# Altium project NB3000AL.PRJPCB (part 4 of 4)

## Sheet CON_FFC40_LCDTFT.SCHDOC: LCD Module Connector
size A4; DocumentNumber: 63; Revision: 01; SheetNumber: 64; SheetTotal: 78
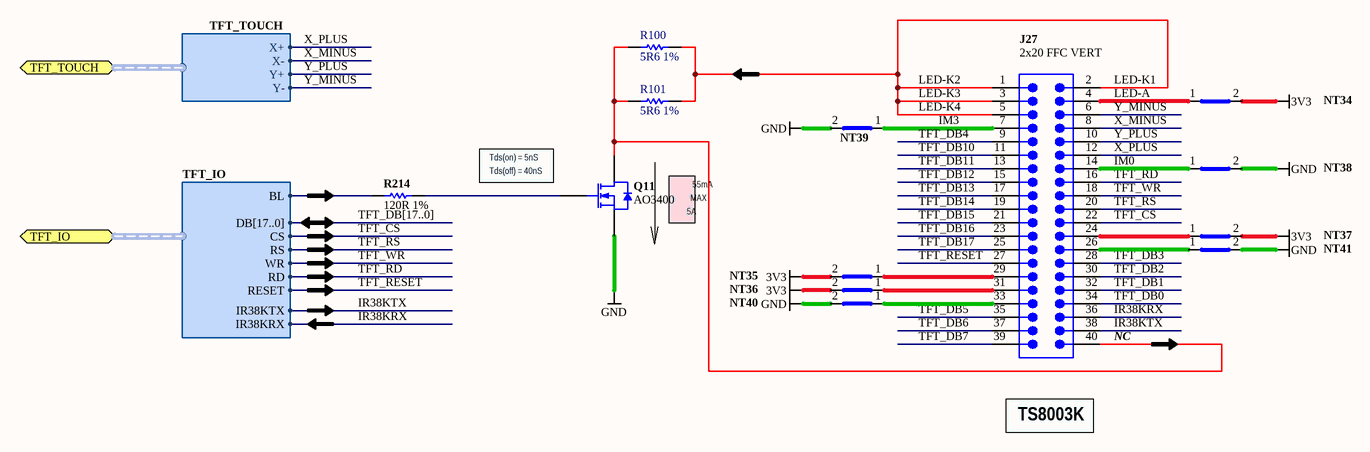
[diagram p27: CON_FFC40_LCDTFT.SCHDOC]

### Parts
J27  2x20 FFC VERT  [FPC-xxS1VN3R]
NT34  Net Tie SMT2  [NETTIE-SMT2-8X8]  (value not drawn)  (net tie, no BOM)
NT35  Net Tie SMT2  [NETTIE-SMT2-8X8]  (value not drawn)  (net tie, no BOM)
NT36  Net Tie SMT2  [NETTIE-SMT2-8X8]  (value not drawn)  (net tie, no BOM)
NT37  Net Tie SMT2  [NETTIE-SMT2-8X8]  (value not drawn)  (net tie, no BOM)
NT38  Net Tie SMT2  [NETTIE-SMT2-8X8]  (value not drawn)  (net tie, no BOM)
NT39  Net Tie SMT2  [NETTIE-SMT2-8X8]  (value not drawn)  (net tie, no BOM)
NT40  Net Tie SMT2  [NETTIE-SMT2-8X8]  (value not drawn)  (net tie, no BOM)
NT41  Net Tie SMT2  [NETTIE-SMT2-8X8]  (value not drawn)  (net tie, no BOM)
Q11  AO3400  [SOT95P230-3D]
R100  5R6 1%  [RESC1005-STAR]
R101  5R6 1%  [RESC1005-STAR]
R214  120R 1%  [RESC1005-STAR]

### Ports
TFT_IO (harness TFT_IO), TFT_TOUCH (harness TFT_TOUCH)

### Harnesses
TFT_IO: CS, RS, WR, RD, RESET, DB[17..0], BL, IR38KTX, IR38KRX
TFT_TOUCH: X+, X-, Y+, Y-

### Nets
3V3: NT34.2(Net2) NT35.2(Net2) NT36.2(Net2) NT37.2(Net2)
GND: NT38.2(Net2) NT39.2(Net2) NT40.2(Net2) NT41.2(Net2) Q11.3(S)
IR38KRX: J27.36 ; port TFT_IO.IR38KRX
IR38KTX: J27.38 ; port TFT_IO.IR38KTX
TFT_CS: J27.22 ; port TFT_IO.CS
TFT_DB0: J27.34
TFT_DB1: J27.32
TFT_DB2: J27.30
TFT_DB3: J27.28
TFT_DB4: J27.9
TFT_DB5: J27.35
TFT_DB6: J27.37
TFT_DB7: J27.39
TFT_DB10: J27.11
TFT_DB11: J27.13
TFT_DB12: J27.15
TFT_DB13: J27.17
TFT_DB14: J27.19
TFT_DB15: J27.21
TFT_DB16: J27.23
TFT_DB17: J27.25
TFT_RD: J27.16 ; port TFT_IO.RD
TFT_RESET: J27.27 ; port TFT_IO.RESET
TFT_RS: J27.20 ; port TFT_IO.RS
TFT_WR: J27.18 ; port TFT_IO.WR
X_MINUS: J27.8 ; port TFT_TOUCH.X-
X_PLUS: J27.12 ; port TFT_TOUCH.X+
Y_MINUS: J27.6 ; port TFT_TOUCH.Y-
Y_PLUS: J27.10 ; port TFT_TOUCH.Y+
NetJ27_1: J27.1 J27.2 J27.3 J27.5 R100.1 R101.1
NetJ27_4: J27.4 NT34.1(Net1)
NetJ27_7: J27.7 NT39.1(Net1)
NetJ27_14: J27.14 NT38.1(Net1)
NetJ27_24: J27.24 NT37.1(Net1)
NetJ27_26: J27.26 NT41.1(Net1)
NetJ27_29: J27.29 NT35.1(Net1)
NetJ27_31: J27.31 NT36.1(Net1)
NetJ27_33: J27.33 NT40.1(Net1)
NetJ27_40: J27.40 Q11.2(D) R100.2 R101.2
NetQ11_1: Q11.1(G) R214.1
NetR214_2: R214.2 ; port TFT_IO.BL

### Buses and harness runs
bus TFT_DB[17..0]

### Notes on the sheet
- LED-K3
- LED-K2
- LED-K4
- (near NT39) IM3
- LED-K1
- LED-A
- (near Q11) Tds(on) = 5nS
- (near Q11) Tds(off) = 40nS
- 55mA
- (near J27) IM0
- 5A
- MAX
- (near J27) NC
- TS8003K
- Sheet Title
- Project Title
- Size:
- Date:
- A4
- Assy:
- Time:
- Revision:
- Sheet
- of
- File:

### Library data of the parts
J27 = D-300-0125: Header FFC, 2x20 pin Vertical, 0.5mm; Connector type: Straight; Max Current: mA; Mounting Technology: Surface Mount; Pin Count: 40; Status: Unreleased; Category: Connector
NT34-NT41 = D-002-0003: as NT9 on sheet TSC_XPT2046; Category: Net-Tie; Status: Production
Q11 = D-158-0005: N-channel Enhancement Mode Field-effect Transistor;  5.8A/30V; Transistor Type: NPN; Mounting Technology: Surface Mount; Status: Unreleased; Category: Transistor-FET
R100 R101 = D-100-0085: Resistor, 5R6 1% 0402 (1005); Power Rating: 63mW; Resistance: 5.6R; Category: Resistor; Mounting Technology: Surface Mount; Status: Production; Tolerance: 1%
R214 = D-100-0126: Resistor, 120R 1% 0402 (1005); Power Rating: 63 mW; Category: Resistor; Mounting Technology: Surface Mount; Resistance: 120 R; Status: Production; Tolerance: 1 %

## Sheet Mounts.SchDoc: NB3000AL Holes and Graphics
size A4; Organization: Altium Limited.; DocumentNumber: 19; Revision: 6; SheetNumber: 20; SheetTotal: 78
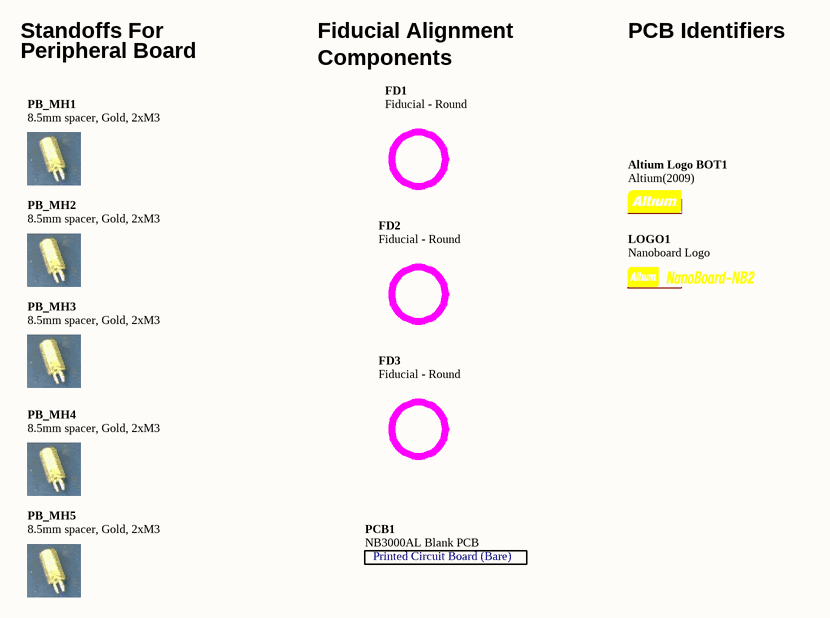
[diagram p28: Mounts.SchDoc]

### Parts
Altium_Logo_BOT1  Altium(2009)  [Logo-Altium-New]  (no BOM)
FD1  Fiducial - Round  [FIDUCIAL ROUND]  (no BOM)
FD2  Fiducial - Round  [FIDUCIAL ROUND]  (no BOM)
FD3  Fiducial - Round  [FIDUCIAL ROUND]  (no BOM)
LOGO1  Nanoboard Logo  [NANOBOARD LOGO]  (no BOM)
PB_MH1  8.5mm spacer, Gold, 2xM3  [STANDOFF_SOLDER_3MM]
PB_MH2  8.5mm spacer, Gold, 2xM3  [STANDOFF_SOLDER_3MM]
PB_MH3  8.5mm spacer, Gold, 2xM3  [STANDOFF_SOLDER_3MM]
PB_MH4  8.5mm spacer, Gold, 2xM3  [STANDOFF_SOLDER_3MM]
PB_MH5  8.5mm spacer, Gold, 2xM3  [STANDOFF_SOLDER_3MM]
PCB1  NB3000AL Blank PCB

### Nets
SHIELD: PB_MH1.STAND PB_MH2.STAND PB_MH3.STAND PB_MH4.STAND PB_MH5.STAND

### Notes on the sheet
- Peripheral Board
- Standoffs For
- Fiducial Alignment
- Components
- PCB Identifiers
- Sheet Title
- Project Title
- Size:
- Date:
- A4
- Assy:
- Time:
- Revision:
- Sheet
- of
- File:
- (in symbol D-810-0053) Printed Circuit Board (Bare)

### Library data of the parts
Altium_Logo_BOT1 = D-000-0003: Altium Logo for PCB; Category: Graphic-PCB; Status: Production
FD1-FD3 = D-004-0001: Fiducial - Round 1.5mm Top-Bottom; Status: Unreleased; Category: Fiducial
LOGO1 = D-000-0000: Status: Production; Category: Graphic-PCB
PB_MH1-PB_MH5 = D-306-0001: Spacer, 8.5mm GOLD, Splitted bottom, Female M3-thread; Category: Standoff; Status: Production
PCB1 = D-810-0053: NB3000AL Blank PCB - NanoBoard  3000 Series with Altera Cyclone3; ProjectPath: NB3000AL.PrjPCB; Status: Unreleased; Category: Blank PCB

## Sheet ADC_ADC084S021_SPI.SchDoc: ADC084S021 8-Bit ADC IC
size A4; DocumentNumber: 26; SheetNumber: 27; SheetTotal: 77
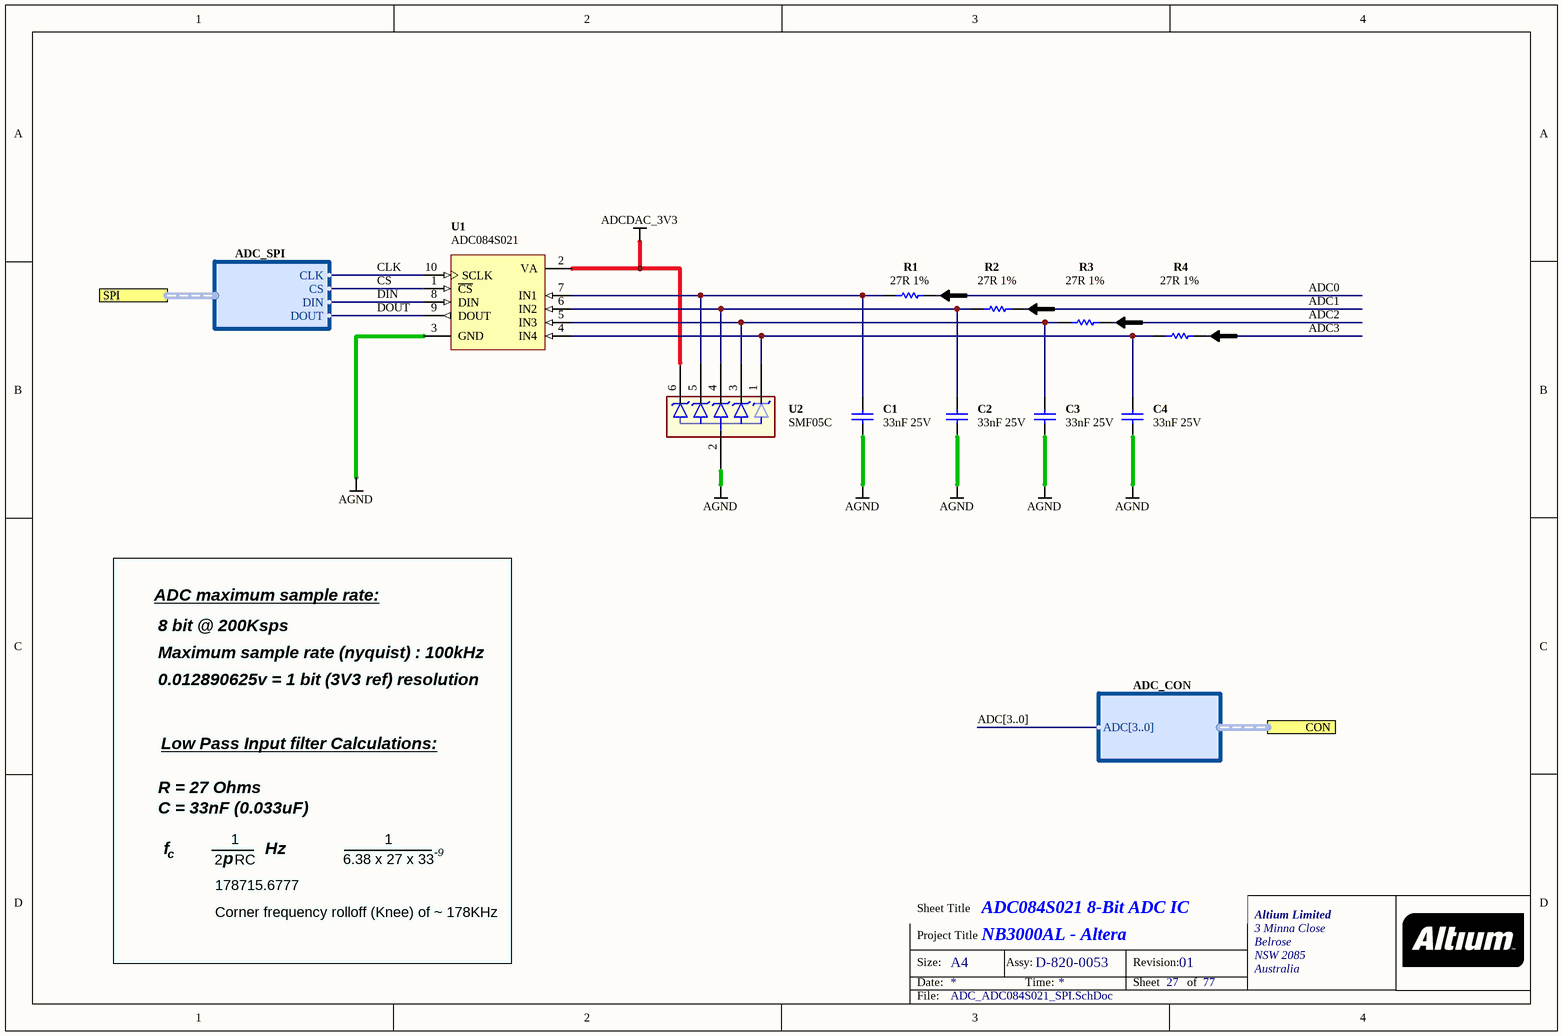
[diagram p29: ADC_ADC084S021_SPI.SchDoc]

### Parts
(Parts that share a designator on the sheet are numbered #1, #2 ... from top to bottom, then left to right.)
C1#6  33nF 25V  [CAPC1005-STAR]
C2#7  33nF 25V  [CAPC1005-STAR]
C3#7  33nF 25V  [CAPC1005-STAR]
C4#6  33nF 25V  [CAPC1005-STAR]
R1#8  27R 1%  [RESC1005-STAR]
R2#9  27R 1%  [RESC1005-STAR]
R3#8  27R 1%  [RESC1005-STAR]
R4#6  27R 1%  [RESC1005-STAR]
U1#7  ADC084S021  [TSSOP50P490-10AN]
U2#3  SMF05C  [SC70_6L]

### Ports
CON (harness ADC_CON), SPI (harness ADC_SPI)

### Harnesses
ADC_SPI: CS, CLK, DIN, DOUT
ADC_CON: ADC[3..0]

### Nets
ADCDAC_3V3: U1#7.2(VA) U2#3.6
AGND: C1#6.2 C2#7.2 C3#7.2 C4#6.2 U1#7.3(GND) U2#3.2
ADC0: R1#8.1
ADC1: R2#9.1
ADC2: R3#8.1
ADC3: R4#6.1
CLK: U1#7.10(SCLK) ; port SPI.CLK
CS: U1#7.1(~{CS}) ; port SPI.CS
DIN: U1#7.8(DIN) ; port SPI.DIN
DOUT: U1#7.9(DOUT) ; port SPI.DOUT
NetC1#6_1: C1#6.1 R1#8.2 U1#7.7(IN1) U2#3.5
NetC2#7_1: C2#7.1 R2#9.2 U1#7.6(IN2) U2#3.4
NetC3#7_1: C3#7.1 R3#8.2 U1#7.5(IN3) U2#3.3
NetC4#6_1: C4#6.1 R4#6.2 U1#7.4(IN4) U2#3.1

### Buses and harness runs
bus ADC[3..0]

### Notes on the sheet
- ADC maximum sample rate:
- 8 bit @ 200Ksps
- Maximum sample rate (nyquist) : 100kHz
- 0.012890625v = 1 bit (3V3 ref) resolution
- Low Pass Input filter Calculations:
- R = 27 Ohms
- C = 33nF (0.033uF)
- f
- 1
- Hz
- -9
- c
- 2   RC
- 178715.6777
- Corner frequency rolloff (Knee) of ~ 178KHz
- p
- 6.38 x 27 x 33
- Sheet Title
- Project Title
- Size:
- Date:
- A4
- Assy:
- Time:
- Revision:
- Sheet
- of
- File:

### Library data of the parts
C1#6 C2#7 C3#7 C4#6 = D-101-0133: Capacitor, Ceramic, 33nF 10% 25V 0402 (1005) X7R; Polarity: Non-Polarized; Category: Capacitor; Capacitance: 33 nF; Dielectric: X7R; Mounting Technology: Surface Mount; Rated Voltage: 25 V; Status: Production; Technology: Ceramic; Tolerance: 10 %
R1#8 R2#9 R3#8 R4#6 = D-100-0108: Resistor, 27R 1% 0402 (1005); Power Rating: 63 mW; Category: Resistor; Mounting Technology: Surface Mount; Resistance: 27 R; Status: Production; Tolerance: 1 %
U1#7 = D-220-0004: ADC084S021, 8-bit ADC, 4 Channel, 50 ksps to 200ksps, SPI; Bit Width: 8Bits; Max Sample Frequency: 100KHz; Supply Voltage: 2.7 to 5.25V; Digital Interface: SPI; Mounting Technology: Surface Mount; Status: Unreleased; Temperature Range: -40 to +85 degC; Category: IC-ADC
U2#3 = D-157-0000: TVS Diode Array  For ESD and Latch-Up Protection; Junction Capacitance: 130 pF; Peak Pulse Current: 8 A; Peak Pulse Power: 100 W; Reverse Breakdown Voltage: 6 V; Status: Unreleased; Category: Diode-Protection

## Sheet CON_NB3000_ATE_INTF.SchDoc: ATE Interface Connector
size A4; Organization: Altium Limited.; Address1: Level 3, 12a Rodborough Rd; Address2: Frenchs Forest 2086; Address3: NSW; Address4: AUSTRALIA; DocumentNumber: 56; SheetNumber: 57; SheetTotal: 77
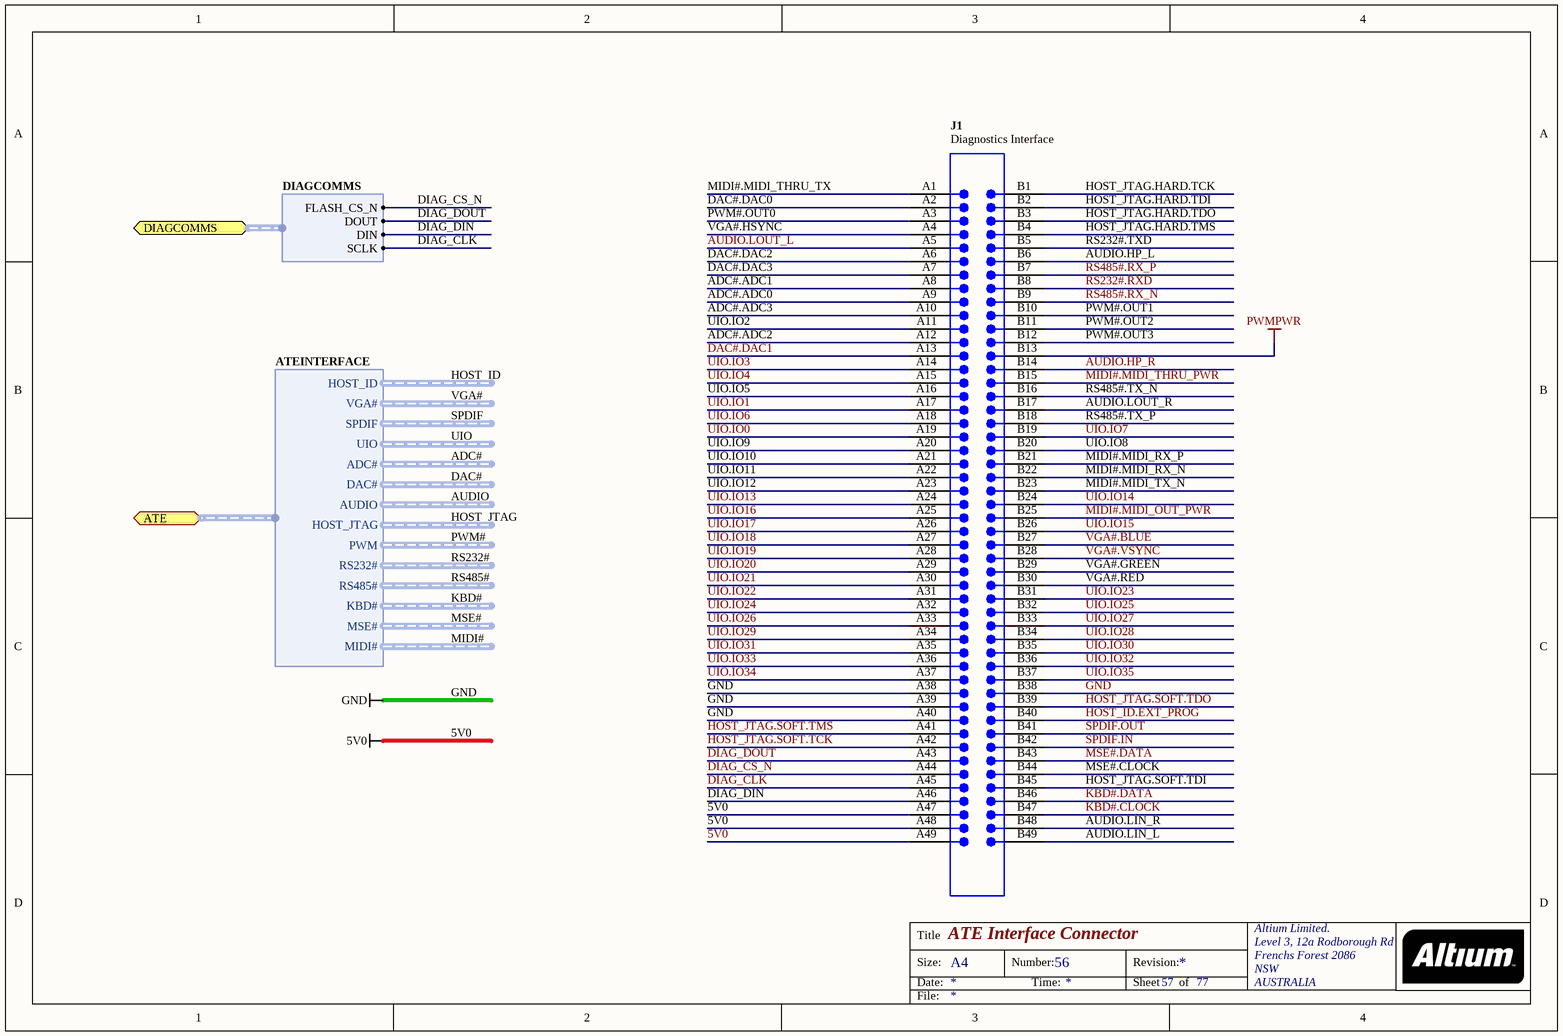
[diagram p30: CON_NB3000_ATE_INTF.SchDoc]

### Parts
(Parts that share a designator on the sheet are numbered #1, #2 ... from top to bottom, then left to right.)
J1#5  Diagnostics Interface  [EDGE-PCIE-X8]  (no BOM)

### Ports
ATE (harness ATEINTERFACE), DIAGCOMMS (harness DIAGCOMMS)

### Harnesses
DIAGCOMMS: DIN, DOUT, SCLK, FLASH_CS_N
ATEINTERFACE: VGA#, SPDIF, UIO, ADC#, DAC#, AUDIO, HOST_JTAG, PWM, RS232#, RS485#, KBD#, MSE#, MIDI#, HOST_ID

### Nets
5V0: J1#5.A47 J1#5.A48 J1#5.A49
GND: J1#5.A38 J1#5.A39 J1#5.A40 J1#5.B38
PWMPWR: J1#5.B13
ADC#.ADC0: J1#5.A9
ADC#.ADC1: J1#5.A8
ADC#.ADC2: J1#5.A12
ADC#.ADC3: J1#5.A10
AUDIO.HP_L: J1#5.B6
AUDIO.HP_R: J1#5.B14
AUDIO.LIN_L: J1#5.B49
AUDIO.LIN_R: J1#5.B48
AUDIO.LOUT_L: J1#5.A5
AUDIO.LOUT_R: J1#5.B17
DAC#.DAC0: J1#5.A2
DAC#.DAC1: J1#5.A13
DAC#.DAC2: J1#5.A6
DAC#.DAC3: J1#5.A7
DIAG_CLK: J1#5.A45 ; port DIAGCOMMS.SCLK
DIAG_CS_N: J1#5.A44 ; port DIAGCOMMS.FLASH_CS_N
DIAG_DIN: J1#5.A46 ; port DIAGCOMMS.DIN
DIAG_DOUT: J1#5.A43 ; port DIAGCOMMS.DOUT
HOST_ID.EXT_PROG: J1#5.B40
HOST_JTAG.HARD.TCK: J1#5.B1
HOST_JTAG.HARD.TDI: J1#5.B2
HOST_JTAG.HARD.TDO: J1#5.B3
HOST_JTAG.HARD.TMS: J1#5.B4
HOST_JTAG.SOFT.TCK: J1#5.A42
HOST_JTAG.SOFT.TDI: J1#5.B45
HOST_JTAG.SOFT.TDO: J1#5.B39
HOST_JTAG.SOFT.TMS: J1#5.A41
KBD#.CLOCK: J1#5.B47
KBD#.DATA: J1#5.B46
MIDI#.MIDI_OUT_PWR: J1#5.B25
MIDI#.MIDI_RX_N: J1#5.B22
MIDI#.MIDI_RX_P: J1#5.B21
MIDI#.MIDI_THRU_PWR: J1#5.B15
MIDI#.MIDI_THRU_TX: J1#5.A1
MIDI#.MIDI_TX_N: J1#5.B23
MSE#.CLOCK: J1#5.B44
MSE#.DATA: J1#5.B43
PWM#.OUT0: J1#5.A3
PWM#.OUT1: J1#5.B10
PWM#.OUT2: J1#5.B11
PWM#.OUT3: J1#5.B12
RS232#.RXD: J1#5.B8
RS232#.TXD: J1#5.B5
RS485#.RX_N: J1#5.B9
RS485#.RX_P: J1#5.B7
RS485#.TX_N: J1#5.B16
RS485#.TX_P: J1#5.B18
SPDIF.IN: J1#5.B42
SPDIF.OUT: J1#5.B41
UIO.IO0: J1#5.A19
UIO.IO1: J1#5.A17
UIO.IO2: J1#5.A11
UIO.IO3: J1#5.A14
UIO.IO4: J1#5.A15
UIO.IO5: J1#5.A16
UIO.IO6: J1#5.A18
UIO.IO7: J1#5.B19
UIO.IO8: J1#5.B20
UIO.IO9: J1#5.A20
UIO.IO10: J1#5.A21
UIO.IO11: J1#5.A22
UIO.IO12: J1#5.A23
UIO.IO13: J1#5.A24
UIO.IO14: J1#5.B24
UIO.IO15: J1#5.B26
UIO.IO16: J1#5.A25
UIO.IO17: J1#5.A26
UIO.IO18: J1#5.A27
UIO.IO19: J1#5.A28
UIO.IO20: J1#5.A29
UIO.IO21: J1#5.A30
UIO.IO22: J1#5.A31
UIO.IO23: J1#5.B31
UIO.IO24: J1#5.A32
UIO.IO25: J1#5.B32
UIO.IO26: J1#5.A33
UIO.IO27: J1#5.B33
UIO.IO28: J1#5.B34
UIO.IO29: J1#5.A34
UIO.IO30: J1#5.B35
UIO.IO31: J1#5.A35
UIO.IO32: J1#5.B36
UIO.IO33: J1#5.A36
UIO.IO34: J1#5.A37
UIO.IO35: J1#5.B37
VGA#.BLUE: J1#5.B27
VGA#.GREEN: J1#5.B29
VGA#.HSYNC: J1#5.A4
VGA#.RED: J1#5.B30
VGA#.VSYNC: J1#5.B28

### Notes on the sheet
- Title
- Size:
- Date:
- A4
- Number:
- Time:
- Revision:
- Sheet
- of
- File:

### Library data of the parts
J1#5 = D-300-0115: Connector, PCI Express, Used for Automatic Test Equipment (ATE); Connector type: Straight; Max Current: 1.1/pinA; Mounting Technology: Surface Mount; Pin Count: 98; Status: Unreleased; Category: Connector

## Sheet AUDIO_AMP_NB2C.SchDoc: AUDIO SUB-SYSTEM
size A4; Organization: Altium Limited.; Address1: 3 Minna Close; Address2: Belrose; Address3: NSW 2085; Address4: AUSTRALIA; DocumentNumber: 16; SheetNumber: 17; SheetTotal: 78; PageSetup: Record=PageOptions|CenterHorizontal=True|CenterVertical=True|PrintScale=0.97|XCorrection=1.00|YCorrection=1.00|PrintKind=0|BorderSize=5000000|LeftOffset=0|BottomOffset=0|Orientation=2|PaperLength=1000|PaperWidth=1000|Scale=100|PaperSource=7|PrintQuality=-4|MediaType=1|DitherType=10|PaperKind=A4 (210 x 297 mm)|PrintScaleMode=1
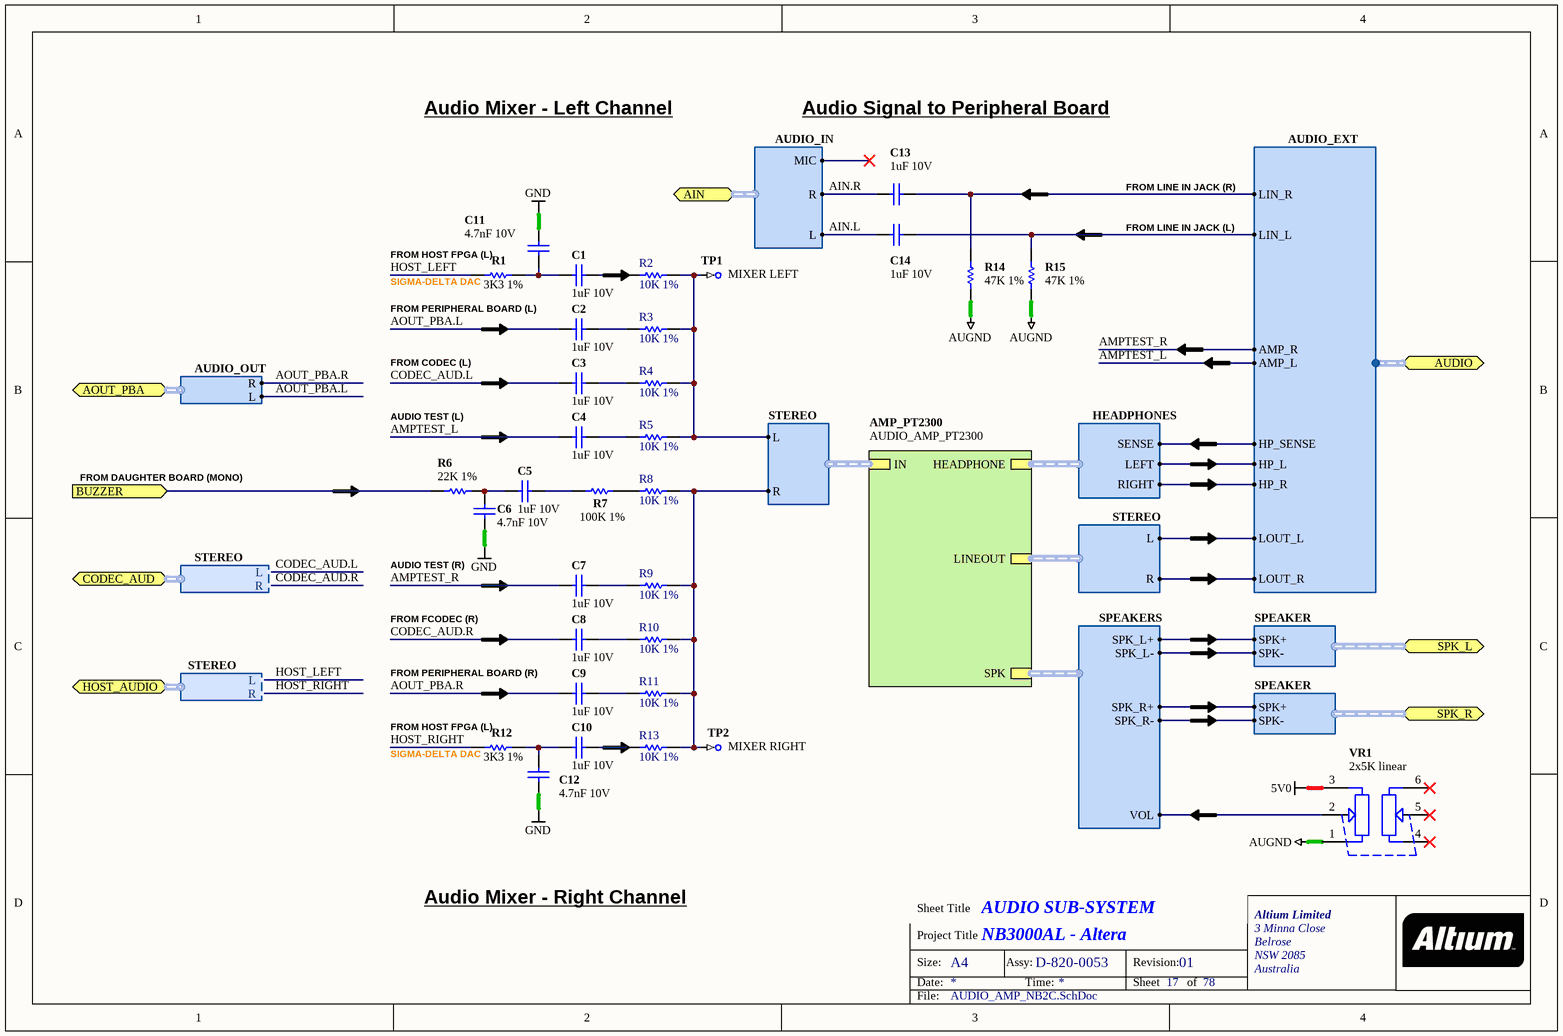
[diagram p31: AUDIO_AMP_NB2C.SchDoc]

### Parts
(Parts that share a designator on the sheet are numbered #1, #2 ... from top to bottom, then left to right.)
C1#7  1uF 10V  [CAPC1005-STAR]
C2#8  1uF 10V  [CAPC1005-STAR]
C3#8  1uF 10V  [CAPC1005-STAR]
C4#7  1uF 10V  [CAPC1005-STAR]
C5#5  1uF 10V  [CAPC1005-STAR]
C6#4  4.7nF 10V  [CAPC1005-STAR]
C7#4  1uF 10V  [CAPC1005-STAR]
C8#4  1uF 10V  [CAPC1005-STAR]
C9#4  1uF 10V  [CAPC1005-STAR]
C10#3  1uF 10V  [CAPC1005-STAR]
C11#3  4.7nF 10V  [CAPC1005-STAR]
C12#3  4.7nF 10V  [CAPC1005-STAR]
C13#3  1uF 10V  [CAPC1005-STAR]
C14#3  1uF 10V  [CAPC1005-STAR]
R1#9  3K3 1%  [RESC1005-STAR]
R2#10  10K 1%  [RESC1005-STAR]
R3#9  10K 1%  [RESC1005-STAR]
R4#7  10K 1%  [RESC1005-STAR]
R5#4  10K 1%  [RESC1005-STAR]
R6#5  22K 1%  [RESC1005-STAR]
R7#5  100K 1%  [RESC1005-STAR]
R8#5  10K 1%  [RESC1005-STAR]
R9#5  10K 1%  [RESC1005-STAR]
R10#4  10K 1%  [RESC1005-STAR]
R11#3  10K 1%  [RESC1005-STAR]
R12#4  3K3 1%  [RESC1005-STAR]
R13#2  10K 1%  [RESC1005-STAR]
R14#3  47K 1%  [RESC1005-STAR]
R15#2  47K 1%  [RESC1005-STAR]
TP1#2  MIXER LEFT  [TestPin]  (no BOM)
TP2#2  MIXER RIGHT  [TestPin]  (no BOM)
VR1  2x5K linear  [POT-R0911G-A1]

### Sub-sheets
AMP_PT2300 = AUDIO_AMP_PT2300: SPK (harness SPEAKERS), IN (harness STEREO), LINEOUT (harness STEREO), HEADPHONE (harness HEADPHONES)

### Ports
AIN (harness AUDIO_IN), AOUT_PBA (harness AUDIO_OUT), AUDIO (harness AUDIO_EXT), BUZZER (in), CODEC_AUD (harness STEREO), HOST_AUDIO (harness STEREO), SPK_L (harness SPEAKER), SPK_R (harness SPEAKER)

### Harnesses
AUDIO_EXT: AMP_L, AMP_R, HP_L, HP_R, HP_SENSE, LIN_L, LIN_R, LOUT_L, LOUT_R
STEREO: R, L
HEADPHONES: RIGHT, LEFT, SENSE
SPEAKER: SPK-, SPK+
SPEAKERS: SPK_L-, SPK_L+, SPK_R-, SPK_R+, VOL
AUDIO_IN: L, R, MIC
STEREO: L, R
AUDIO_OUT: L, R

### Nets
5V0: VR1.3
AUGND: R14#3.1 R15#2.1 VR1.1
GND: C6#4.2 C11#3.2 C12#3.2
AIN.L: C14#3.2 ; port AIN.L
AIN.R: C13#3.2 ; port AIN.R
AMPTEST_L: C4#7.2 ; port AUDIO.AMP_L
AMPTEST_R: C7#4.2 ; port AUDIO.AMP_R
AOUT_PBA.L: C2#8.2 ; port AOUT_PBA.L
AOUT_PBA.R: C9#4.2 ; port AOUT_PBA.R
BUZZER: R6#5.1 ; port BUZZER
CODEC_AUD.L: C3#8.2 ; port CODEC_AUD.L
CODEC_AUD.R: C8#4.2 ; port CODEC_AUD.R
HOST_LEFT: R1#9.1 ; port HOST_AUDIO.L
HOST_RIGHT: R12#4.1 ; port HOST_AUDIO.R
NetC1#7_1: C1#7.1 R2#10.1
NetC1#7_2: C1#7.2 C11#3.1 R1#9.2
NetC2#8_1: C2#8.1 R3#9.1
NetC3#8_1: C3#8.1 R4#7.1
NetC4#7_1: C4#7.1 R5#4.1
NetC5#5_1: C5#5.1 R7#5.1
NetC5#5_2: C5#5.2 C6#4.1 R6#5.2
NetC7#4_1: C7#4.1 R9#5.1
NetC8#4_1: C8#4.1 R10#4.1
NetC9#4_1: C9#4.1 R11#3.1
NetC10#3_1: C10#3.1 R13#2.1
NetC10#3_2: C10#3.2 C12#3.1 R12#4.2
NetC12#4_1: port SPK_L.SPK-, sheet AMP_PT2300/SPK.SPK_L-
NetC12#4_2: port AUDIO.HP_L, sheet AMP_PT2300/HEADPHONE.LEFT
NetC13#3_1: C13#3.1 R14#3.2 ; port AUDIO.LIN_R
NetC14#3_1: C14#3.1 R15#2.2 ; port AUDIO.LIN_L
NetC14#4_2: port AUDIO.LOUT_L, sheet AMP_PT2300/LINEOUT.L
NetC15#2_2: VR1.2 ; sheet AMP_PT2300/SPK.VOL
NetC16_1: sheet AMP_PT2300/SPK.SPK_R-, port SPK_R.SPK-
NetC16_2: port AUDIO.HP_R, sheet AMP_PT2300/HEADPHONE.RIGHT
NetC18_1: port AUDIO.LOUT_R, sheet AMP_PT2300/LINEOUT.R
NetR2#10_2: R2#10.2 R3#9.2 R4#7.2 R5#4.2 TP1#2.1 ; sheet AMP_PT2300/IN.L
NetR7#5_2: R7#5.2 R8#5.1
NetR8#5_2: R8#5.2 R9#5.2 R10#4.2 R11#3.2 R13#2.2 TP2#2.1 ; sheet AMP_PT2300/IN.R
NetR10#5_1: port AUDIO.HP_SENSE, sheet AMP_PT2300/HEADPHONE.SENSE
NetU1#8_9: sheet AMP_PT2300/SPK.SPK_R+, port SPK_R.SPK+
NetU1#8_16: port SPK_L.SPK+, sheet AMP_PT2300/SPK.SPK_L+

Not connected (* = marked no-connect by the designer): VR1 4* 5* 6*

### Notes on the sheet
- Audio Mixer - Left Channel
- Audio Signal to Peripheral Board
- FROM LINE IN JACK (R)
- FROM LINE IN JACK (L)
- (near R1#9) FROM PERIPHERAL BOARD (L)
- (near R1#9) FROM HOST FPGA (L)
- (near R1#9) SIGMA-DELTA DAC
- FROM CODEC (L)
- AUDIO TEST (L)
- FROM DAUGHTER BOARD (MONO)
- AUDIO TEST (R)
- FROM FCODEC (R)
- FROM PERIPHERAL BOARD (R)
- (near R12#4) FROM HOST FPGA (L)
- (near R12#4) SIGMA-DELTA DAC
- Audio Mixer - Right Channel
- Sheet Title
- Project Title
- Size:
- Date:
- A4
- Assy:
- Time:
- Revision:
- Sheet
- of
- File:

### Library data of the parts
C1#7 C2#8 C3#8 C4#7 C5#5 C7#4 C8#4 C9#4 C10#3 C13#3 C14#3 = D-101-0131: Capacitor, Ceramic, 1uF 10% 10V 0402 (1005) X5R; Polarity: Non-Polarized; Category: Capacitor; Capacitance: 1 uF; Dielectric: X5R; Mounting Technology: Surface Mount; Rated Voltage: 10 V; Status: Unreleased; Technology: None; Tolerance: 10 %
C6#4 C11#3 C12#3 = D-101-0132: Capacitor, Ceramic, 4.7nF 10% 10V 0402 (1005) X7R; Polarity: Non-Polarized; Category: Capacitor; Dielectric: X7R; Mounting Technology: Surface Mount; Status: Production; Technology: Ceramic
  C6#4: Capacitance: 4.7 nF; Rated Voltage: 10 V; Tolerance: 10 %
  C11#3 C12#3: Capacitance: 4.7nF; Rated Voltage: 10V; Tolerance: 10%
R1#9 R12#4 = D-100-0098: Resistor, 3K3 1% 0402 (1005); Power Rating: 63 mW; Resistance: 3.3 K; Category: Resistor; Mounting Technology: Surface Mount; Status: Production; Tolerance: 1 %
R2#10 R3#9 R4#7 R5#4 R8#5 R9#5 R10#4 R11#3 R13#2 = D-100-0130: Resistor, 10K 1% 0402 (1005); Power Rating: 63mW; Category: Resistor; Mounting Technology: Surface Mount; Resistance: 10K; Status: Production; Tolerance: 1%
R6#5 = D-100-0114: Resistor, 22K 1% 0402 (1005); Power Rating: mW; Category: Resistor; Mounting Technology: Surface Mount; Resistance: 22 K; Status: Production; Tolerance: 1 %
R7#5 = D-100-0132: Resistor, 100K 1% 0402 (1005); Power Rating: 63 mW; Category: Resistor; Mounting Technology: Surface Mount; Resistance: 100 K; Status: Production; Tolerance: 1 %
R14#3 R15#2 = D-100-0092: Resistor, 47K 1% 0402 (1005); Power Rating: 63 mW; Category: Resistor; Mounting Technology: Surface Mount; Resistance: 47 K; Status: Production; Tolerance: 1 %
TP1#2 TP2#2 = D-006-0000: Test Point, PCB Mount with Silkscreen Box; Category: Test-Point; Status: Production
VR1 = D-105-0001: Potentiometer, 2 x 5K Linear 9mm PCB Mount Fluted Shaft; Category: Potentiometer; Status: Production

## Sheet AUDIO_AMP_PT2300.SchDoc: AUDIO AMP & MIXER PT2300
size A4; Organization: Altium Limited.; Address1: 3 Minna Close; Address2: Belrose; Address3: NSW 2085; Address4: AUSTRALIA; DocumentNumber: 30; SheetNumber: 31; SheetTotal: 78; PageSetup: Record=PageOptions|CenterHorizontal=True|CenterVertical=True|PrintScale=0.97|XCorrection=1.00|YCorrection=1.00|PrintKind=0|BorderSize=5000000|LeftOffset=0|BottomOffset=0|Orientation=2|PaperLength=1000|PaperWidth=1000|Scale=100|PaperSource=7|PrintQuality=-4|MediaType=1|DitherType=10|PaperKind=A4 (210 x 297 mm)|PrintScaleMode=1
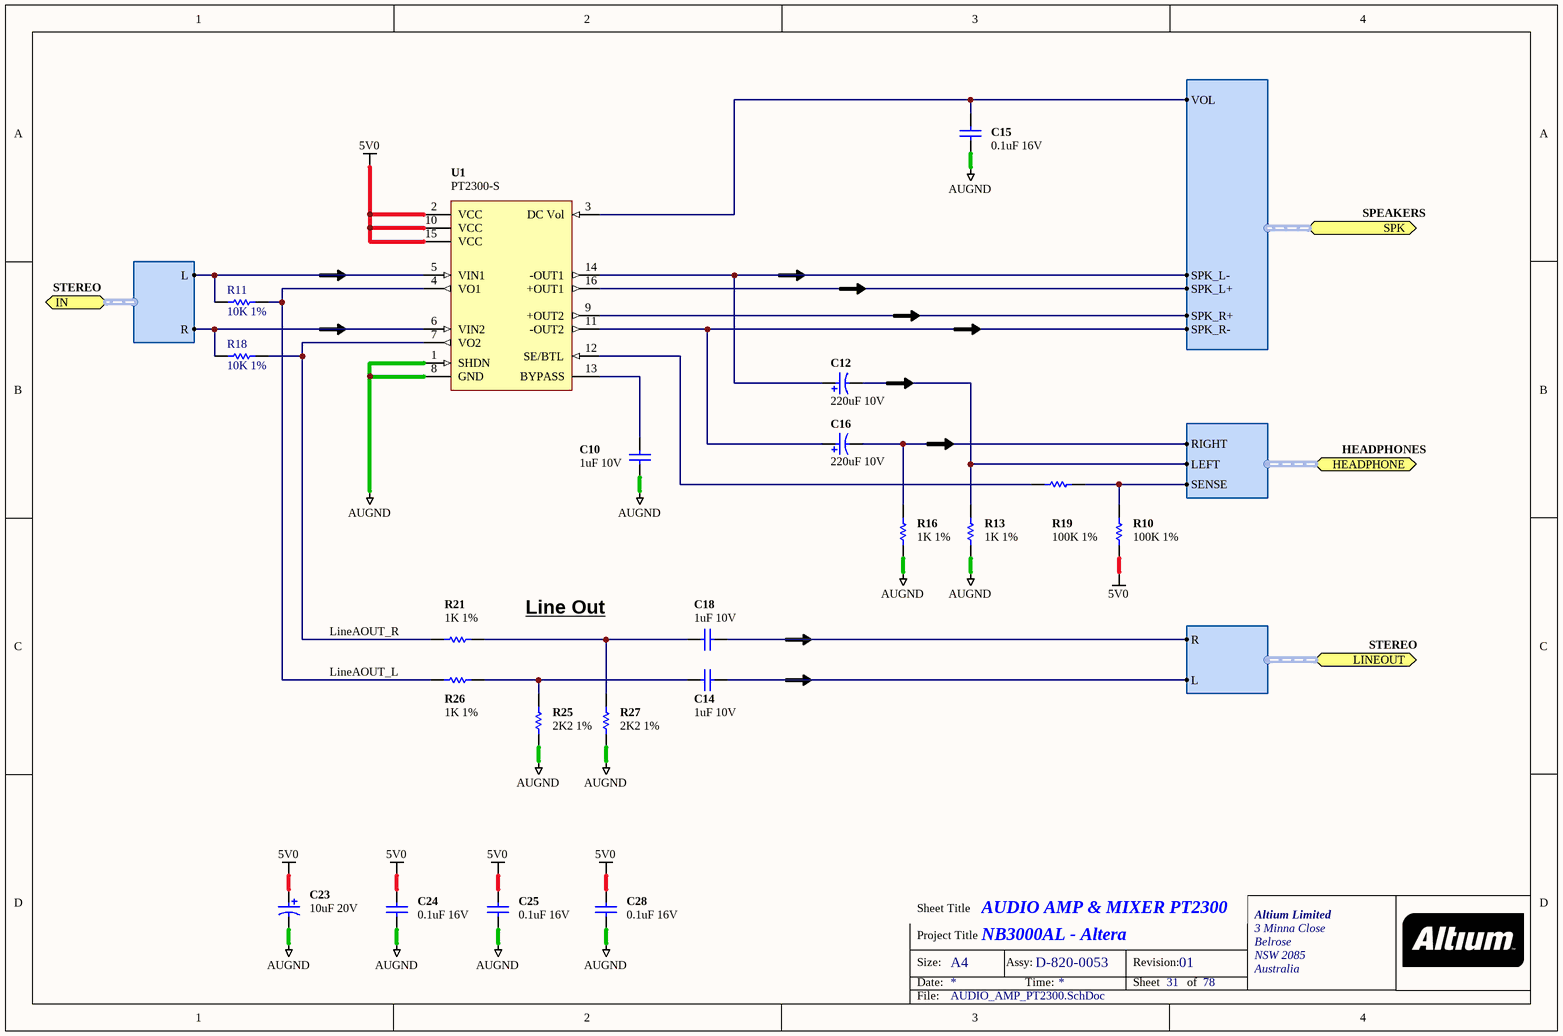
[diagram p32: AUDIO_AMP_PT2300.SchDoc]

### Parts
(Parts that share a designator on the sheet are numbered #1, #2 ... from top to bottom, then left to right.)
C10#4  1uF 10V  [CAPC1005-STAR]
C12#4  220uF 10V  [CAPC7343-STAR]
C14#4  1uF 10V  [CAPC1005-STAR]
C15#2  0.1uF 16V  [CAPC1005-STAR]
C16  220uF 10V  [CAPC7343-STAR]
C18  1uF 10V  [CAPC1005-STAR]
C23  10uF 20V  [CAPC3528-STAR]
C24  0.1uF 16V  [CAPC1005-STAR]
C25  0.1uF 16V  [CAPC1005-STAR]
C28  0.1uF 16V  [CAPC1005-STAR]
R10#5  100K 1%  [RESC1005-STAR]
R11#4  10K 1%  [RESC1005-STAR]
R13#3  1K 1%  [RESC1005-STAR]
R16#2  1K 1%  [RESC1005-STAR]
R18#3  10K 1%  [RESC1005-STAR]
R19#2  100K 1%  [RESC1005-STAR]
R21#2  1K 1%  [RESC1005-STAR]
R25#2  2K2 1%  [RESC1005-STAR]
R26#2  1K 1%  [RESC1005-STAR]
R27#2  2K2 1%  [RESC1005-STAR]
U1#8  PT2300-S  [SOIC127P1030-16N]

### Ports
HEADPHONE (harness HEADPHONES), IN (harness STEREO), LINEOUT (harness STEREO), SPK (harness SPEAKERS)

### Harnesses
SPEAKERS: SPK_L-, SPK_L+, SPK_R-, SPK_R+, VOL
STEREO: R, L
HEADPHONES: RIGHT, LEFT, SENSE

### Nets
5V0: C23.1 C24.2 C25.2 C28.2 R10#5.2 U1#8.2(VCC) U1#8.10(VCC) U1#8.15(VCC)
AUGND: C10#4.2 C15#2.1 C23.2 C24.1 C25.1 C28.1 R13#3.1 R16#2.1 R25#2.1 R27#2.2 U1#8.1(SHDN) U1#8.8(GND)
LineAOUT_L: R11#4.2 R26#2.1 U1#8.4(VO1)
LineAOUT_R: R18#3.2 R21#2.1 U1#8.7(VO2)
NetC10#4_1: C10#4.1 U1#8.13(BYPASS)
NetC12#4_1: C12#4.1 U1#8.14(-OUT1) ; port SPK.SPK_L-
NetC12#4_2: C12#4.2 R13#3.2 ; port HEADPHONE.LEFT
NetC14#4_1: C14#4.1 R25#2.2 R26#2.2
NetC14#4_2: C14#4.2 ; port LINEOUT.L
NetC15#2_2: C15#2.2 U1#8.3(DC_Vol) ; port SPK.VOL
NetC16_1: C16.1 U1#8.11(-OUT2) ; port SPK.SPK_R-
NetC16_2: C16.2 R16#2.2 ; port HEADPHONE.RIGHT
NetC18_1: C18.1 ; port LINEOUT.R
NetC18_2: C18.2 R21#2.2 R27#2.1
NetR2#10_2: R11#4.1 U1#8.5(VIN1) ; port IN.L
NetR8#5_2: R18#3.1 U1#8.6(VIN2) ; port IN.R
NetR10#5_1: R10#5.1 R19#2.2 ; port HEADPHONE.SENSE
NetR19#2_1: R19#2.1 U1#8.12(SE/BTL)
NetU1#8_9: U1#8.9(+OUT2) ; port SPK.SPK_R+
NetU1#8_16: U1#8.16(+OUT1) ; port SPK.SPK_L+

### Notes on the sheet
- Line Out
- Sheet Title
- Project Title
- Size:
- Date:
- A4
- Assy:
- Time:
- Revision:
- Sheet
- of
- File:

### Library data of the parts
C10#4 C14#4 C18 = D-101-0131: as C1#7 on sheet AUDIO_AMP_NB2C; Category: Capacitor; Capacitance: 1 uF; Dielectric: X5R; Mounting Technology: Surface Mount; Rated Voltage: 10 V; Status: Unreleased; Technology: None; Tolerance: 10 %
C12#4 C16 = D-101-0088: Capacitor, Tantalum, 220uF 10% 10V MCCT-D (7343-31); Polarity: Polarized; Category: Capacitor; Capacitance: 220 uF; Mounting Technology: Surface Mount; Rated Voltage: 10 V; Status: Unreleased; Technology: Tantalum; Tolerance: 10 %
C15#2 C24 C25 C28 = D-101-0080: Capacitor, Ceramic, 0.1uF 10% 16V 0402 (1005) X7R; Polarity: Non-Polarized; Category: Capacitor; Capacitance: 0.1 uF; Dielectric: X7R; Mounting Technology: Surface Mount; Rated Voltage: 16 V; Status: Production; Technology: Ceramic; Tolerance: 10 %
C23 = D-101-0007: Capacitor, Tantalum, 10uF 10% 20V MCCT-B (3528); Polarity: Polarized; Category: Capacitor; Capacitance: 10 uF; Mounting Technology: Surface Mount; Rated Voltage: 20 V; Status: Production; Technology: Tantalum; Tolerance: 10 %
R10#5 R19#2 = D-100-0132: as R7#5 on sheet AUDIO_AMP_NB2C; Category: Resistor; Mounting Technology: Surface Mount; Resistance: 100 K; Status: Production; Tolerance: 1 %
R11#4 R18#3 = D-100-0130: as R2#10 on sheet AUDIO_AMP_NB2C; Category: Resistor; Mounting Technology: Surface Mount; Resistance: 10K; Status: Production; Tolerance: 1%
R13#3 R16#2 R21#2 R26#2 = D-100-0121: Resistor, 1K 1% 0402 (1005); Power Rating: 63 mW; Category: Resistor; Mounting Technology: Surface Mount; Resistance: 1 K; Status: Production; Tolerance: 1 %
R25#2 R27#2 = D-100-0107: Resistor, 2K2 1% 0402 (1005); Power Rating: 63 mW; Resistance: 2.2 K; Category: Resistor; Mounting Technology: Surface Mount; Status: Production; Tolerance: 1 %
U1#8 = D-201-0007: PT2300, 2W x 2 Class AB Audio Power Amplifier; Supply Voltage: 5 V; AudioICTypes: Amplifier; Mounting Technology: Surface Mount; Status: Unreleased; Temperature Range: -40 to +85 degC; Category: IC-Audio

## Sheet CLK_ICS307-02_PLL.SchDoc: Programmable SPI Clock
size A4; Organization: Altium Limited.; Address1: Level 3, 12a Rodborough Rd; Address2: Frenchs Forest 2086; Address3: NSW; Address4: AUSTRALIA; Revision: 6; SheetNumber: 1; SheetTotal: 100
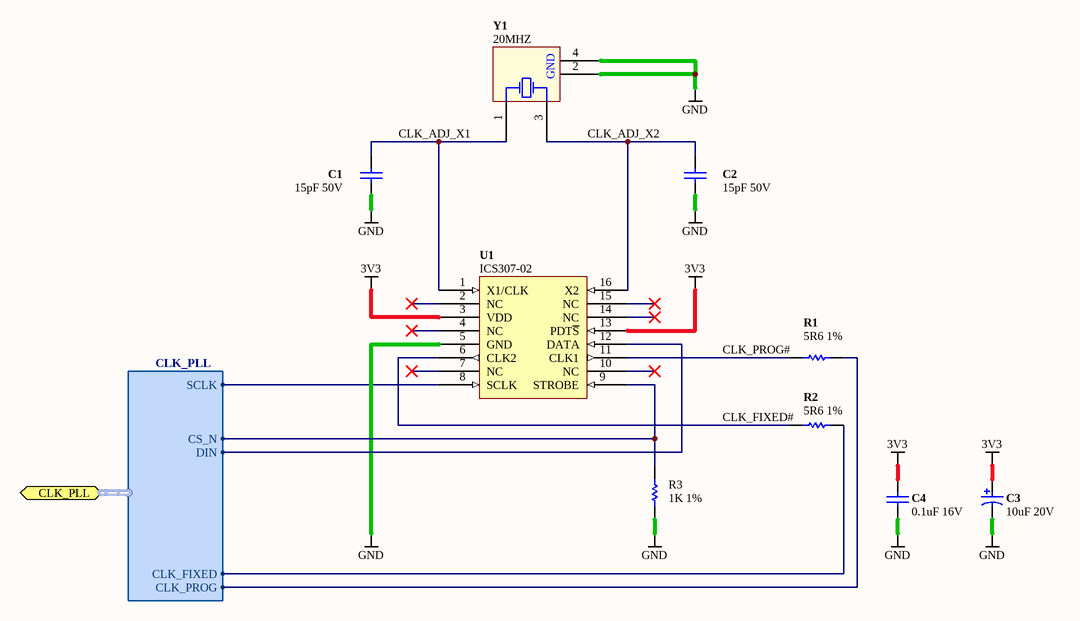
[diagram p33: CLK_ICS307-02_PLL.SchDoc]

### Parts
(Parts that share a designator on the sheet are numbered #1, #2 ... from top to bottom, then left to right.)
C1#8  15pF 50V  [CAPC1005-STAR]
C2#9  15pF 50V  [CAPC1005-STAR]
C3#9  10uF 20V  [CAPC3528-STAR]
C4#8  0.1uF 16V  [CAPC1005-STAR]
R1#10  5R6 1%  [RESC1005-STAR]
R2#11  5R6 1%  [RESC1005-STAR]
R3#10  1K 1%  [RESC1005-STAR]
U1#9  ICS307-02  [SOIC127P600-16]
Y1#3  20MHZ  [XTAL-200X126-4]

### Ports
CLK_PLL (harness CLK_PLL)

### Harnesses
CLK_PLL: CLK_FIXED, CLK_PROG, CS_N, DIN, SCLK

### Nets
3V3: C3#9.1 C4#8.1 U1#9.3(VDD) U1#9.13(PDT~{S})
GND: C1#8.2 C2#9.2 C3#9.2 C4#8.2 R3#10.2 U1#9.5(GND) Y1#3.2(GND) Y1#3.4(GND)
CLK_ADJ_X1: C1#8.1 U1#9.1(X1/CLK) Y1#3.1(X1)
CLK_ADJ_X2: C2#9.1 U1#9.16(X2) Y1#3.3(X2)
CLK_FIXED#: R2#11.2 U1#9.6(CLK2)
CLK_PROG#: R1#10.2 U1#9.11(CLK1)
NetR1#10_1: R1#10.1 ; port CLK_PLL.CLK_PROG
NetR2#11_1: R2#11.1 ; port CLK_PLL.CLK_FIXED
NetR3#10_1: R3#10.1 U1#9.9(STROBE) ; port CLK_PLL.CS_N
NetU1#9_8: U1#9.8(SCLK) ; port CLK_PLL.SCLK
NetU1#9_12: U1#9.12(DATA) ; port CLK_PLL.DIN

Not connected (* = marked no-connect by the designer): U1#9 2(NC)* 4(NC)* 7(NC)* 10(NC)* 14(NC)* 15(NC)*

### Notes on the sheet
- Sheet Title
- Project Title
- Size:
- Date:
- A4
- Assy:
- Time:
- Revision:
- Sheet
- of
- File:

### Library data of the parts
C1#8 C2#9 = D-101-0075: Capacitor, Ceramic, 15pF 5% 50V 0402 (1005); Dielectric: C0G; Polarity: Non-Polarized; Category: Capacitor; Capacitance: 15 pF; Mounting Technology: Surface Mount; Rated Voltage: 50 V; Status: Production; Technology: Ceramic; Tolerance: 5 %
C3#9 = D-101-0007: as C23 on sheet AUDIO_AMP_PT2300; Category: Capacitor; Capacitance: 10 uF; Mounting Technology: Surface Mount; Rated Voltage: 20 V; Status: Production; Technology: Tantalum; Tolerance: 10 %
C4#8 = D-101-0080: as C15#2 on sheet AUDIO_AMP_PT2300; Category: Capacitor; Capacitance: 0.1 uF; Dielectric: X7R; Mounting Technology: Surface Mount; Rated Voltage: 16 V; Status: Production; Technology: Ceramic; Tolerance: 10 %
R1#10 R2#11 = D-100-0085: Resistor, 5R6 1% 0402 (1005); Power Rating: 63 mW; Resistance: 5.6 R; Category: Resistor; Status: Production; Mounting Technology: Surface Mount; Tolerance: 1 %
R3#10 = D-100-0121: as R13#3 on sheet AUDIO_AMP_PT2300; Category: Resistor; Mounting Technology: Surface Mount; Resistance: 1 K; Status: Production; Tolerance: 1 %
U1#9 = D-206-0000: ICS307-02, SPI Programmable Clock Generator; Category: IC-Clock; Status: Production
Y1#3 = D-103-0012: Crystal, SMD, 20.000000MHz Stab=30ppm 20.0pF; Frequency Stability: 30 ppm; Load Capacitance: 20 pF; Nominal Operational Voltage: mV; Category: Crystal; Frequency Tolerance: 30 ppm; Mounting Technology: Surface Mount; Nominal Fequency: 20 MHz; Status: Unreleased

## Sheet CON_ADCx4_KMRJIO3_5MM_6WAY.SchDoc: Screw Header For ADC
size A4; Organization: Altium Limited.; Address1: Level 3, 12a Rodborough Rd; Address2: Frenchs Forest 2086; Address3: NSW; Address4: AUSTRALIA; DocumentNumber: 12; SheetNumber: 13; SheetTotal: 77
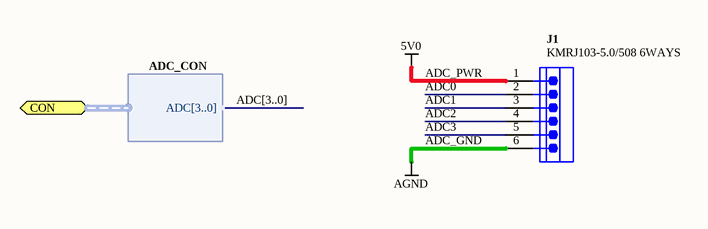
[diagram p34: CON_ADCx4_KMRJIO3_5MM_6WAY.SchDoc]

### Parts
(Parts that share a designator on the sheet are numbered #1, #2 ... from top to bottom, then left to right.)
J1#6  KMRJ103-5.0/508 6WAYS  [KMRJ103-5-508-6]

### Ports
CON (harness ADC_CON)

### Harnesses
ADC_CON: ADC[3..0]

### Nets
5V0: J1#6.1  [also labelled ADC_PWR]
AGND: J1#6.6  [also labelled ADC_GND]
ADC0: J1#6.2
ADC1: J1#6.3
ADC2: J1#6.4
ADC3: J1#6.5

### Buses and harness runs
bus ADC[3..0]

### Notes on the sheet
- Sheet Title
- Project Title
- Size:
- Date:
- A4
- Assy:
- Time:
- Revision:
- Sheet
- of
- File:

### Library data of the parts
J1#6 = D-300-0122: Socket, Screw Terminal Block, 6 Way, 5.0mm pitch, 45 degree angle, Through-hole; Connector type: Header; Max Current: 300V/10A A; Mounting Technology: Through-Hole; Pin Count: 6; Status: Unreleased; Category: Connector

## Sheet CON_BATT_COIN.SchDoc: Lithium Battery Holder - CR2032
size A4; Organization: Altium Limited.; SheetNumber: 1; SheetTotal: 100
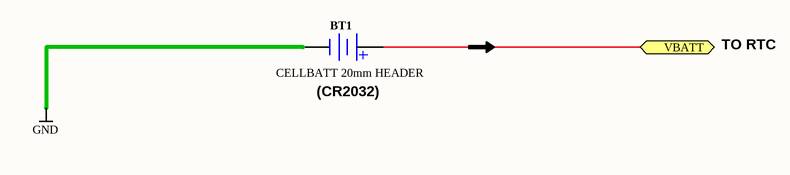
[diagram p35: CON_BATT_COIN.SchDoc]

### Parts
BT1  CELLBATT 20mm HEADER  [CELL_HOLDER]

### Ports
VBATT

### Nets
GND: BT1.2(-)
VBATT: BT1.1(+) ; port VBATT

### Notes on the sheet
- TO RTC
- (near BT1) (CR2032)
- Sheet Title
- Project Title
- Size:
- Date:
- A4
- Assy:
- Time:
- Revision:
- Sheet
- of
- File:

### Library data of the parts
BT1 = D-302-0000: Lithium Battery Holder for CR2032 3V Cell; Category: Battery; Mounting Technology: Through-Hole; Nominal output Voltage: 3 V; Status: Production

## Sheet CON_DACx4_KMRJIO3_5MM_6WAY.SchDoc: Screw Header For DAC
size A4; Organization: Altium Limited.; Address1: Level 3, 12a Rodborough Rd; Address2: Frenchs Forest 2086; Address3: NSW; Address4: AUSTRALIA; DocumentNumber: 12; SheetNumber: 13; SheetTotal: 77
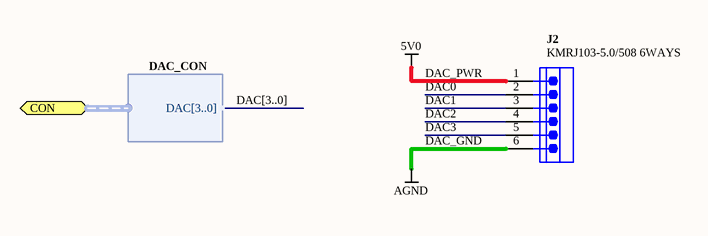
[diagram p36: CON_DACx4_KMRJIO3_5MM_6WAY.SchDoc]

### Parts
(Parts that share a designator on the sheet are numbered #1, #2 ... from top to bottom, then left to right.)
J2#2  KMRJ103-5.0/508 6WAYS  [KMRJ103-5-508-6]

### Ports
CON (harness DAC_CON)

### Harnesses
DAC_CON: DAC[3..0]

### Nets
5V0: J2#2.1  [also labelled DAC_PWR]
AGND: J2#2.6  [also labelled DAC_GND]
DAC0: J2#2.2
DAC1: J2#2.3
DAC2: J2#2.4
DAC3: J2#2.5

### Buses and harness runs
bus DAC[3..0]

### Notes on the sheet
- Sheet Title
- Project Title
- Size:
- Date:
- A4
- Assy:
- Time:
- Revision:
- Sheet
- of
- File:

### Library data of the parts
J2#2 = D-300-0122: as J1#6 on sheet CON_ADCx4_KMRJIO3_5MM_6WAY; Mounting Technology: Through-Hole; Pin Count: 6; Status: Unreleased; Category: Connector

## Sheet CON_MINI_USBB_RA_KME04-USBMU03A01-1.SchDoc: USB 2.0 Type B Connector
size A4; Organization: Altium Limited.; Address1: Level 3, 12a Rodborough Rd; Address2: Frenchs Forest 2086; Address3: NSW; Address4: AUSTRALIA; DocumentNumber: 64; SheetNumber: 65; SheetTotal: 77
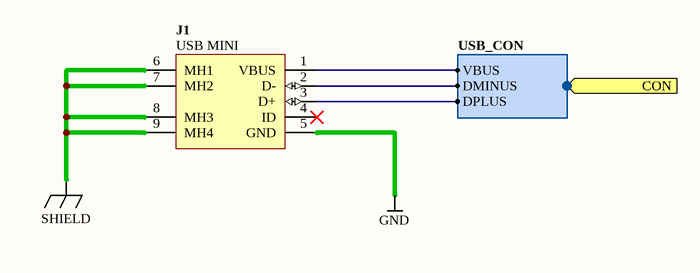
[diagram p37: CON_MINI_USBB_RA_KME04-USBMU03A01-1.SchDoc]

### Parts
(Parts that share a designator on the sheet are numbered #1, #2 ... from top to bottom, then left to right.)
J1#7  USB MINI  [USB-MOLEX-675031020]

### Ports
CON (harness USB_CON)

### Harnesses
USB_CON: VBUS, DMINUS, DPLUS

### Nets
GND: J1#7.5(GND)
SHIELD: J1#7.6(MH1) J1#7.7(MH2) J1#7.8(MH3) J1#7.9(MH4)
NetJ1#7_1: J1#7.1(VBUS) ; port CON.VBUS
NetJ1#7_2: J1#7.2(D-) ; port CON.DMINUS
NetJ1#7_3: J1#7.3(D+) ; port CON.DPLUS

Not connected (* = marked no-connect by the designer): J1#7 4(ID)*

### Notes on the sheet
- Sheet Title
- Project Title
- Size:
- Date:
- A4
- Assy:
- Time:
- Revision:
- Sheet
- of
- File:

### Library data of the parts
J1#7 = D-300-0009: USB, MINI, SMD,  Molex; Connector type: Right Angle; Max Current: mA; Category: Connector; Mounting Technology: Surface Mount; Status: Production

## Sheet CON_ETHERNET_RJ45_LEDS.SchDoc: Ethernet Connector
size A4; DocumentNumber: 23; SheetNumber: 24; SheetTotal: 77
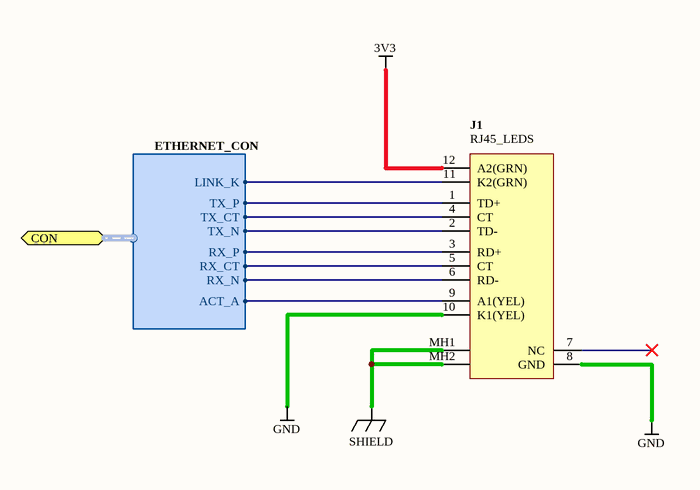
[diagram p38: CON_ETHERNET_RJ45_LEDS.SchDoc]

### Parts
(Parts that share a designator on the sheet are numbered #1, #2 ... from top to bottom, then left to right.)
J1#8  RJ45_LEDS  [CON_RJ45_RA_LEDS]

### Ports
CON (harness ETHERNET_CON)

### Harnesses
ETHERNET_CON: TX_P, TX_N, RX_P, RX_N, RX_CT, TX_CT, LINK_K, ACT_A

### Nets
3V3: J1#8.12(A2(GRN))
GND: J1#8.8(GND) J1#8.10(K1(YEL))
SHIELD: J1#8.MH1 J1#8.MH2
NetJ1#8_1: J1#8.1(TD+) ; port CON.TX_P
NetJ1#8_2: J1#8.2(TD-) ; port CON.TX_N
NetJ1#8_3: J1#8.3(RD+) ; port CON.RX_P
NetJ1#8_4: J1#8.4(CT) ; port CON.TX_CT
NetJ1#8_5: J1#8.5(CT) ; port CON.RX_CT
NetJ1#8_6: J1#8.6(RD-) ; port CON.RX_N
NetJ1#8_9: J1#8.9(A1(YEL)) ; port CON.ACT_A
NetJ1#8_11: J1#8.11(K2(GRN)) ; port CON.LINK_K

Not connected (* = marked no-connect by the designer): J1#8 7(NC)*

### Notes on the sheet
- Sheet Title
- Project Title
- Size:
- Date:
- A4
- Assy:
- Time:
- Revision:
- Sheet
- of
- File:

### Library data of the parts
J1#8 = D-300-0119: Socket, 1x1 Tab-DOWN R/A 8-Way RJ45; Connector type: Right Angle; Max Current: mA; Mounting Technology: Through-Hole; Status: Unreleased; Category: Connector

## Sheet CON_NB3000_LEDKB.SCHDOC: LED and Button Ext. Connector
size A4; DocumentNumber: 65; SheetNumber: 66; SheetTotal: 78
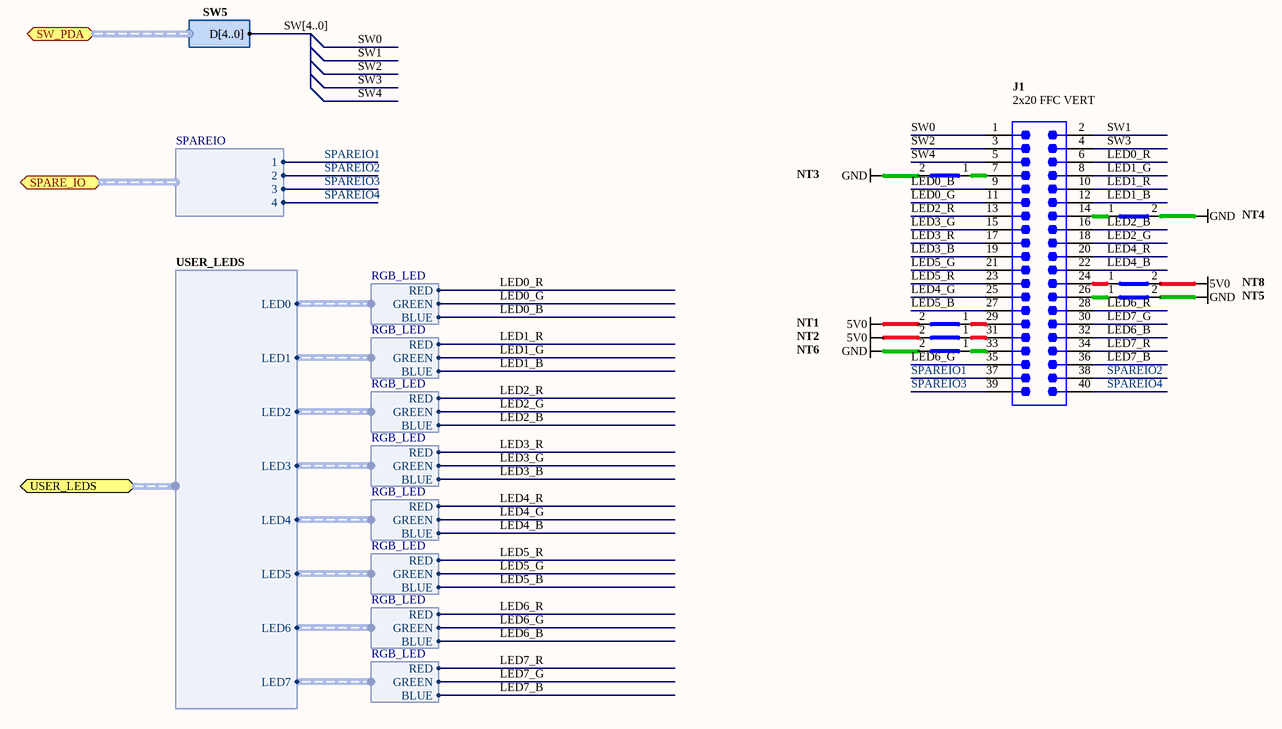
[diagram p39: CON_NB3000_LEDKB.SCHDOC]

### Parts
(Parts that share a designator on the sheet are numbered #1, #2 ... from top to bottom, then left to right.)
J1#9  2x20 FFC VERT  [FPC-xxS1VN3R]
NT1#4  Net Tie SMT2  [NETTIE-SMT2-8X8]  (value not drawn)  (net tie, no BOM)
NT2#3  Net Tie SMT2  [NETTIE-SMT2-8X8]  (value not drawn)  (net tie, no BOM)
NT3#4  Net Tie SMT2  [NETTIE-SMT2-8X8]  (value not drawn)  (net tie, no BOM)
NT4#2  Net Tie SMT2  [NETTIE-SMT2-8X8]  (value not drawn)  (net tie, no BOM)
NT5#2  Net Tie SMT2  [NETTIE-SMT2-8X8]  (value not drawn)  (net tie, no BOM)
NT6  Net Tie SMT2  [NETTIE-SMT2-8X8]  (value not drawn)  (net tie, no BOM)
NT8  Net Tie SMT2  [NETTIE-SMT2-8X8]  (value not drawn)  (net tie, no BOM)

### Ports
SPARE_IO (harness SPAREIO), SW_PDA (harness SW5), USER_LEDS (harness USER_LEDS)

### Harnesses
SW5: D[4..0]
SPAREIO: 1, 2, 3, 4
USER_LEDS: LED0, LED1, LED2, LED3, LED4, LED5, LED6, LED7
RGB_LED: RED, GREEN, BLUE

### Nets
5V0: NT1#4.2(Net2) NT2#3.2(Net2) NT8.2(Net2)
GND: NT3#4.2(Net2) NT4#2.2(Net2) NT5#2.2(Net2) NT6.2(Net2)
LED0_B: J1#9.9 ; harness RGB_LED.BLUE
LED0_G: J1#9.11 ; harness RGB_LED.GREEN
LED0_R: J1#9.6 ; harness RGB_LED.RED
LED1_B: J1#9.12 ; harness RGB_LED.BLUE
LED1_G: J1#9.8 ; harness RGB_LED.GREEN
LED1_R: J1#9.10 ; harness RGB_LED.RED
LED2_B: J1#9.16 ; harness RGB_LED.BLUE
LED2_G: J1#9.18 ; harness RGB_LED.GREEN
LED2_R: J1#9.13 ; harness RGB_LED.RED
LED3_B: J1#9.19 ; harness RGB_LED.BLUE
LED3_G: J1#9.15 ; harness RGB_LED.GREEN
LED3_R: J1#9.17 ; harness RGB_LED.RED
LED4_B: J1#9.22 ; harness RGB_LED.BLUE
LED4_G: J1#9.25 ; harness RGB_LED.GREEN
LED4_R: J1#9.20 ; harness RGB_LED.RED
LED5_B: J1#9.27 ; harness RGB_LED.BLUE
LED5_G: J1#9.21 ; harness RGB_LED.GREEN
LED5_R: J1#9.23 ; harness RGB_LED.RED
LED6_B: J1#9.32 ; harness RGB_LED.BLUE
LED6_G: J1#9.35 ; harness RGB_LED.GREEN
LED6_R: J1#9.28 ; harness RGB_LED.RED
LED7_B: J1#9.36 ; harness RGB_LED.BLUE
LED7_G: J1#9.30 ; harness RGB_LED.GREEN
LED7_R: J1#9.34 ; harness RGB_LED.RED
SPAREIO1: J1#9.37 ; port SPARE_IO.1
SPAREIO2: J1#9.38 ; port SPARE_IO.2
SPAREIO3: J1#9.39 ; port SPARE_IO.3
SPAREIO4: J1#9.40 ; port SPARE_IO.4
SW0: J1#9.1
SW1: J1#9.2
SW2: J1#9.3
SW3: J1#9.4
SW4: J1#9.5
NetJ1#9_7: J1#9.7 NT3#4.1(Net1)
NetJ1#9_14: J1#9.14 NT4#2.1(Net1)
NetJ1#9_24: J1#9.24 NT8.1(Net1)
NetJ1#9_26: J1#9.26 NT5#2.1(Net1)
NetJ1#9_29: J1#9.29 NT1#4.1(Net1)
NetJ1#9_31: J1#9.31 NT2#3.1(Net1)
NetJ1#9_33: J1#9.33 NT6.1(Net1)

### Buses and harness runs
bus SW[4..0]

### Notes on the sheet
- Sheet Title
- Project Title
- Size:
- Date:
- A4
- Assy:
- Time:
- Revision:
- Sheet
- of
- File:

### Library data of the parts
J1#9 = D-300-0125: Header FFC, 2x20 pin Vertical, 0.5mm; Connector type: Straight; Max Current: mA; Mounting Technology: Surface Mount; Pin Count: 40; Status: Unreleased; Category: Connector
NT1#4 NT2#3 NT3#4 NT4#2 NT5#2 NT6 NT8 = D-002-0003: Net-Tie, Surface Mount, 2 x 1.6mm x 0.8mm SMT Pads - For 0.8mm Track; Category: Net-Tie; Status: Production

## Sheet CON_MIDI_DIN5.SCHDOC: MIDI Connectors
size A4; DocumentNumber: 44; SheetNumber: 45; SheetTotal: 77
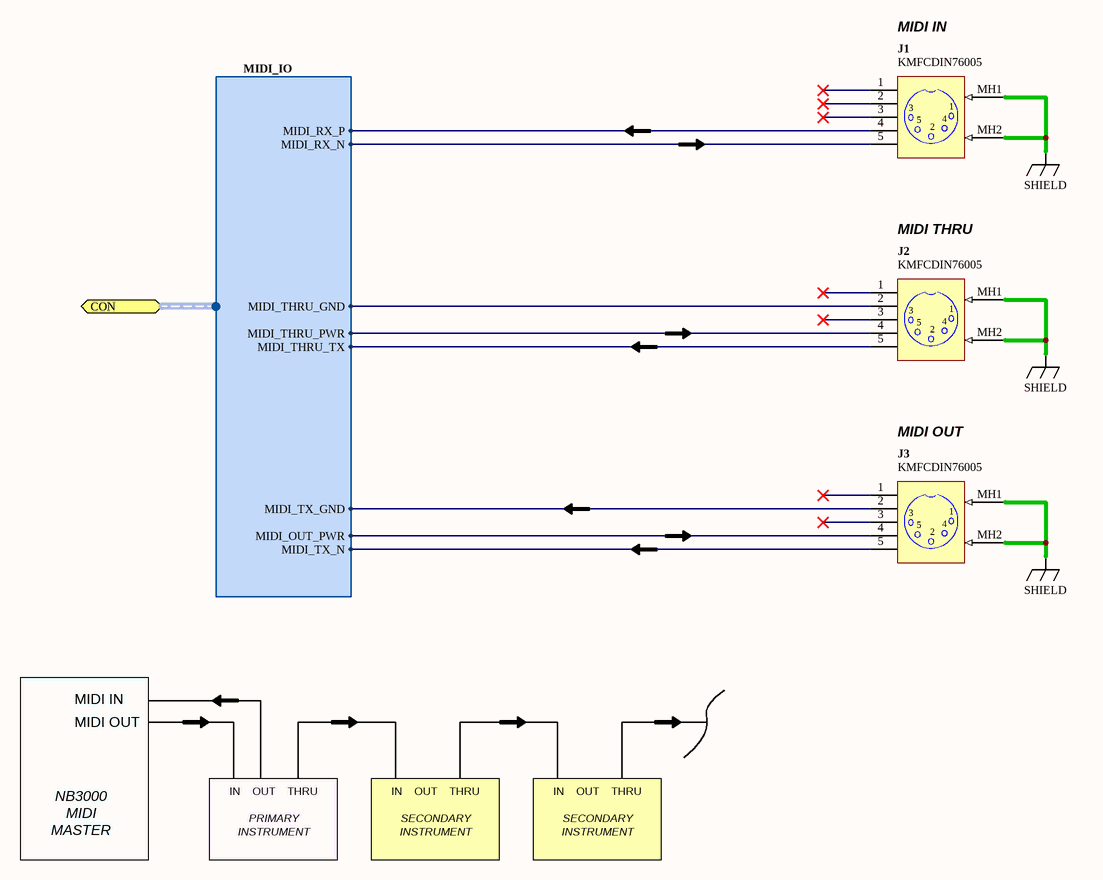
[diagram p40: CON_MIDI_DIN5.SCHDOC]

### Parts
(Parts that share a designator on the sheet are numbered #1, #2 ... from top to bottom, then left to right.)
J1#10  KMFCDIN76005  [KMFCDIN76005]
J2#3  KMFCDIN76005  [KMFCDIN76005]
J3#3  KMFCDIN76005  [KMFCDIN76005]

### Ports
CON (harness MIDI_IO)

### Harnesses
MIDI_IO: MIDI_RX_N, MIDI_RX_P, MIDI_THRU_TX, MIDI_TX_N, MIDI_OUT_PWR, MIDI_TX_GND, MIDI_THRU_GND, MIDI_THRU_PWR

### Nets
SHIELD: J1#10.MH1 J1#10.MH2 J2#3.MH1 J2#3.MH2 J3#3.MH1 J3#3.MH2
NetJ1#10_4: J1#10.4 ; port CON.MIDI_RX_P
NetJ1#10_5: J1#10.5 ; port CON.MIDI_RX_N
NetJ2#3_2: J2#3.2 ; port CON.MIDI_THRU_GND
NetJ2#3_4: J2#3.4 ; port CON.MIDI_THRU_PWR
NetJ2#3_5: J2#3.5 ; port CON.MIDI_THRU_TX
NetJ3#3_2: J3#3.2 ; port CON.MIDI_TX_GND
NetJ3#3_4: J3#3.4 ; port CON.MIDI_OUT_PWR
NetJ3#3_5: J3#3.5 ; port CON.MIDI_TX_N

Not connected (* = marked no-connect by the designer): J1#10 1* 2* 3*; J2#3 1* 3*; J3#3 1* 3*

### Notes on the sheet
- MIDI IN
- MIDI THRU
- MIDI OUT
- NB3000
- MIDI
- IN    OUT    THRU
- PRIMARY
- SECONDARY
- MASTER
- INSTRUMENT
- Sheet Title
- Project Title
- Size:
- Date:
- A4
- Assy:
- Time:
- Revision:
- Sheet
- of
- File:

### Library data of the parts
J1#10 J2#3 J3#3 = D-300-0118: Socket, 5-way R/A DIN; Connector type: Right Angle; Max Current: mA; Mounting Technology: Through-Hole; Status: Unreleased; Category: Connector

## Sheet CON_EXT_SPK.SchDoc: External Speaker Connectors
size A4; DocumentNumber: 6; SheetNumber: 7; SheetTotal: 77
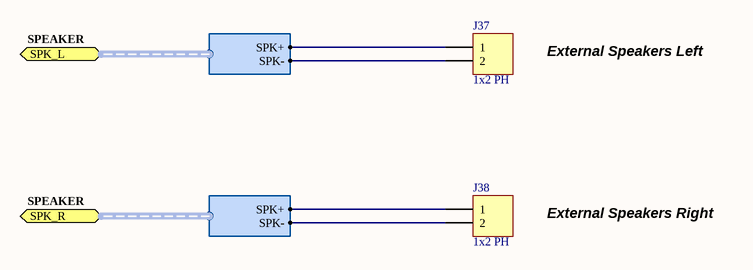
[diagram p41: CON_EXT_SPK.SchDoc]

### Parts
J37  1x2 PH  [PH-2]
J38  1x2 PH  [PH-2]

### Ports
SPK_L (harness SPEAKER), SPK_R (harness SPEAKER)

### Harnesses
SPEAKER: SPK-, SPK+

### Nets
NetJ37_1: J37.1 ; port SPK_L.SPK+
NetJ37_2: J37.2 ; port SPK_L.SPK-
NetJ38_1: J38.1 ; port SPK_R.SPK+
NetJ38_2: J38.2 ; port SPK_R.SPK-

### Notes on the sheet
- External Speakers Left
- External Speakers Right
- Sheet Title
- Project Title
- Size:
- Date:
- A4
- Assy:
- Time:
- Revision:
- Sheet
- of
- File:

### Library data of the parts
J37 J38 = D-300-0131: PH Series 2 x 1 Pin Vertical 2.0mm Pitch (Male); Connector type: Header; Max Current: 2A; Category: Connector; Status: Production; Mounting Technology: Through-Hole; Pin Count: 2

## Sheet 1WB_DS2502_ID.SchDoc: Protected 1-Wire EPROM
size A4; DocumentNumber: 32; SheetNumber: 33; SheetTotal: 77; Organization: Altium Limited.; Address1: Level 3, 12a Rodborough Rd; Address2: Frenchs Forest 2086; Address3: NSW; Address4: AUSTRALIA
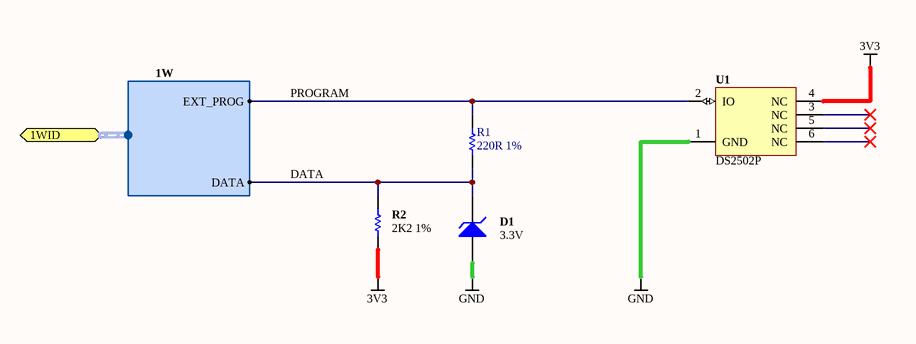
[diagram p42: 1WB_DS2502_ID.SchDoc]

### Parts
(Parts that share a designator on the sheet are numbered #1, #2 ... from top to bottom, then left to right.)
D1#1  3.3V  [SOT95P230-3D]
R1#11  220R 1%  [RESC1005-STAR]
R2#12  2K2 1%  [RESC1005-STAR]
U1#10  DS2502P  [DSO-C6-D4]

### Ports
1WID (harness 1W)

### Harnesses
1W: DATA, EXT_PROG

### Nets
3V3: R2#12.2 U1#10.4(NC)
GND: D1#1.1(A) U1#10.1(GND)
DATA: D1#1.2(K) R1#11.2 R2#12.1 ; port 1WID.DATA
PROGRAM: R1#11.1 U1#10.2(IO) ; port 1WID.EXT_PROG

Not connected (* = marked no-connect by the designer): U1#10 3(NC)* 5(NC)* 6(NC)*

### Notes on the sheet
- Sheet Title
- Project Title
- Size:
- Date:
- A4
- Assy:
- Time:
- Revision:
- Sheet
- of
- File:

### Library data of the parts
D1#1 = D-150-0005: Zener Diode, 3.3V; Max Forward Current: mA; Mounting Technology: Surface Mount; Rated Voltage: 3.3 V; Status: Production; Category: Diode-Zener
R1#11 = D-100-0115: Resistor, 220R 1% 0402 (1005); Power Rating: 63 mW; Category: Resistor; Mounting Technology: Surface Mount; Resistance: 220 R; Status: Production; Tolerance: 1 %
R2#12 = D-100-0107: as R25#2 on sheet AUDIO_AMP_PT2300; Category: Resistor; Mounting Technology: Surface Mount; Status: Production; Tolerance: 1 %
U1#10 = D-263-0008: EPROM, 1-wire, 1024-bit, Surface Mount; Bit Length: Bits; Speed: 15.4 or 125 kbps ps; Supply Voltage: 2.8 to 6 V; Bit Width: Bits; Mounting Technology: Surface Mount; Status: Unreleased; Technology: EE; Temperature Range: -40 to +85 degC; Category: IC-PROM

## Sheet CLK_PCF2123_RTC.SchDoc: SPI Real Time Clock
size A4; Organization: Altium Limited.; Address1: Level 3, 12a Rodborough Rd; Address2: Frenchs Forest 2086; Address3: NSW; Address4: AUSTRALIA; DocumentNumber: 33; Revision: 6; SheetNumber: 34; SheetTotal: 77; PageSetup: Record=PageOptions|CenterHorizontal=True|CenterVertical=True|PrintScale=2.81|XCorrection=1.00|YCorrection=1.00|PrintKind=0|BorderSize=5000000|LeftOffset=0|BottomOffset=0|Orientation=2|PaperLength=1000|PaperWidth=1000|Scale=100|PaperSource=7|PrintQuality=-4|MediaType=1|DitherType=10|PaperKind=A1 (594 x 841mm)|PrintScaleMode=1
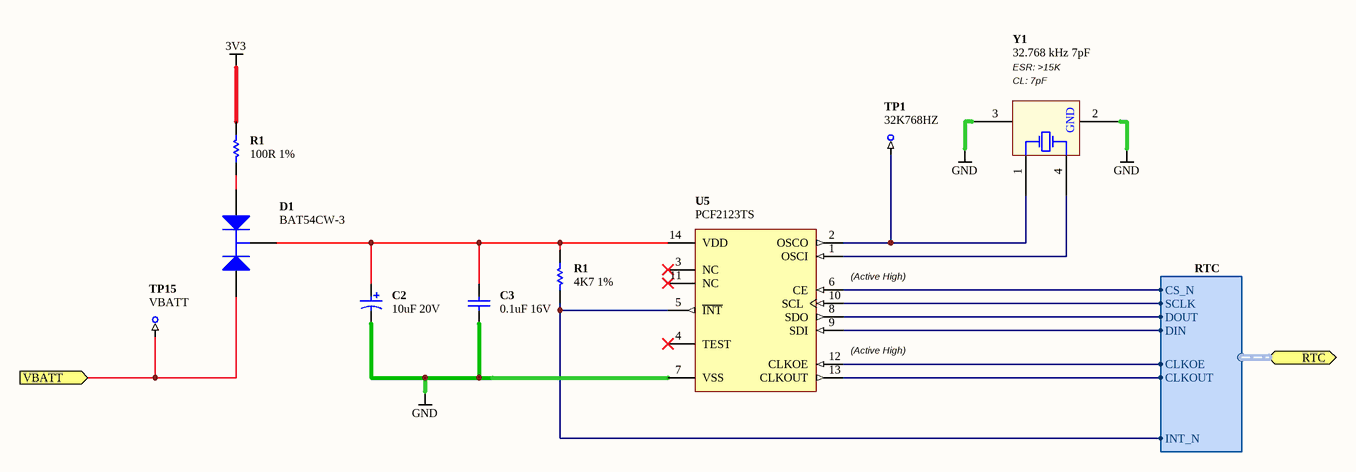
[diagram p43: CLK_PCF2123_RTC.SchDoc]

### Parts
(Parts that share a designator on the sheet are numbered #1, #2 ... from top to bottom, then left to right.)
C2#10  10uF 20V  [CAPC3528-STAR]
C3#10  0.1uF 16V  [CAPC1005-STAR]
D1#2  BAT54CW-3  [SOT323-3AL]
R1#12  100R 1%  [RESC1005-STAR]
R1#13  4K7 1%  [RESC1005-STAR]
TP1#3  32K768HZ  [TestPin]  (no BOM)
TP15  VBATT  [TestPin]  (no BOM)
U5  PCF2123TS  [TSOP65P640-14AN]
Y1#4  32.768 kHz 7pF  [ECS-71]

### Ports
RTC (harness RTC), VBATT (in)

### Harnesses
RTC: CS_N, DIN, DOUT, INT_N, SCLK, CLKOUT, CLKOE

### Nets
3V3: R1#12.1
GND: C2#10.2 C3#10.2 U5.7(VSS) Y1#4.2(GND) Y1#4.3(X2)
VBATT: D1#2.2(A2) TP15.1 ; port VBATT
NetC2#10_1: C2#10.1 C3#10.1 D1#2.3(K) R1#13.1 U5.14(VDD)
NetD1#2_1: D1#2.1(A1) R1#12.2
NetR1#13_2: R1#13.2 U5.5(~{INT}) ; port RTC.INT_N
NetTP1#3_1: TP1#3.1 U5.2(OSCO) Y1#4.1(X1)
NetU5_1: U5.1(OSCI) Y1#4.4(GND)
NetU5_6: U5.6(CE) ; port RTC.CS_N
NetU5_8: U5.8(SDO) ; port RTC.DOUT
NetU5_9: U5.9(SDI) ; port RTC.DIN
NetU5_10: U5.10(SCL) ; port RTC.SCLK
NetU5_12: U5.12(CLKOE) ; port RTC.CLKOE
NetU5_13: U5.13(CLKOUT) ; port RTC.CLKOUT

Not connected (* = marked no-connect by the designer): U5 3(NC)* 4(TEST)* 11(NC)*

### Notes on the sheet
- (near Y1#4) ESR: >15K
- (near Y1#4) CL: 7pF
- (near U5) (Active High)
- Sheet Title
- Project Title
- Size:
- Date:
- A4
- Assy:
- Time:
- Revision:
- Sheet
- of
- File:

### Library data of the parts
C2#10 = D-101-0007: as C23 on sheet AUDIO_AMP_PT2300; Category: Capacitor; Capacitance: 10 uF; Mounting Technology: Surface Mount; Rated Voltage: 20 V; Status: Production; Technology: Tantalum; Tolerance: 10 %
C3#10 = D-101-0080: as C15#2 on sheet AUDIO_AMP_PT2300; Category: Capacitor; Capacitance: 0.1 uF; Dielectric: X7R; Mounting Technology: Surface Mount; Rated Voltage: 16 V; Status: Production; Technology: Ceramic; Tolerance: 10 %
D1#2 = D-155-0001: BAT54CW, SOT-323 Plastic-Encapsulated Diode; Max Forward Current: 200mA; Rated Voltage: 30V; Mounting Technology: Surface Mount; Status: Unreleased; Category: Signal Diode
R1#12 = D-100-0131: Resistor, 100R 1% 0402 (1005); Power Rating: 63 mW; Category: Resistor; Mounting Technology: Surface Mount; Resistance: 100 R; Status: Production; Tolerance: 1 %
R1#13 = D-100-0088: Resistor, 4K7 1% 0402 (1005); Power Rating: 63 mW; Resistance: 4.7 K; Category: Resistor; Mounting Technology: Surface Mount; Status: Production; Tolerance: 1 %
TP1#3 TP15 = D-006-0000: as TP1#2 on sheet AUDIO_AMP_NB2C; Category: Test-Point; Status: Production
U5 = D-206-0006: PCF2123TS, SPI Real time clock/calendar, TSSOP14; Nominal Fequency: 32.768 KHz; Mounting Technology: Surface Mount; Status: Unreleased; Temperature Range: -40 to +85 degC; Category: IC-Clock
Y1#4 = D-103-0031: Crystal, 32.768 KHz Surface Mount; Frequency Stability: 20ppm; Frequency Tolerance: ppm; Nominal Operational Voltage: mV; Load Capacitance: 7pF; Mounting Technology: Surface Mount; Nominal Fequency: 32.768KHz; Status: Production; Category: Crystal

## Nets that join several sheets
1V2: PSU (TP7.1), USER_DECOUPLING_CAPS_1V2 (12 pins), USER_DECOUPLING_CAPS_3V3 (14 pins), FPGA_NonIO (54 pins), HOST_FPGA_NonIO (10 pins), HOST_DECOUPLING_CAPS_1V2 (12 pins), HOST_DECOUPLING_CAPS_3V3 (14 pins)
2V5: PSU (TP5.1), FPGA_NonIO (L4.1 L5.1 L6.1 L7.1), HOST_FPGA_NonIO (L8.1 L9.1)
3V3: VIDEO_DAC_THS8134B (C1#1.1 U1#2.12 U1#2.23 U1#2.24), Audio_Codec (R98.2 R154#1.2 U2000.4), AUDIO_CODEC_CS4270 (5 pins), PSU (TP4.1), FPGA (11 pins), USER_DECOUPLING_CAPS_3V3 (32 pins), FPGA_NonIO (60 pins), Ethernet_RTL8201CL (19 pins), Host_FPGA (6 pins), HOST_FPGA_NonIO (30 pins), HOST_DECOUPLING_CAPS_3V3 (32 pins), TSC_XPT2046 (R2#7.1), USB_CY7C68001-56LFC (19 pins), OSC_24MHZ (C3#6.1 U1#6.5), CON_FFC40_LCDTFT (NT34.2 NT35.2 NT36.2 NT37.2), CLK_ICS307-02_PLL (C3#9.1 C4#8.1 U1#9.3 U1#9.13), CON_ETHERNET_RJ45_LEDS (J1#8.12), 1WB_DS2502_ID (R2#12.2 U1#10.4), CLK_PCF2123_RTC (R1#12.1)
5V0: VIDEO_DAC_THS8134B (L1#1.1), PSU (6 pins), PWJACK+SWITCH (SW1.1 SW1.2), TSC_XPT2046 (NT9.2), CON_NB3000_ATE_INTF (J1#5.A47 J1#5.A48 J1#5.A49), AUDIO_AMP_NB2C (VR1.3), AUDIO_AMP_PT2300 (8 pins), CON_ADCx4_KMRJIO3_5MM_6WAY (J1#6.1), CON_DACx4_KMRJIO3_5MM_6WAY (J2#2.1), CON_NB3000_LEDKB (NT1#4.2 NT2#3.2 NT8.2)
+B: PSU (TP3.1), PWJACK+SWITCH (D10.2 J1#2.1 SW1.3)
ADCDAC_3V3: PSU (NT2#1.1), ADC_ADC084S021_SPI (U1#7.2 U2#3.6)
AGND: PSU (NT3#1.1 NT11#1.1), ADC_ADC084S021_SPI (6 pins), CON_ADCx4_KMRJIO3_5MM_6WAY (J1#6.6), CON_DACx4_KMRJIO3_5MM_6WAY (J2#2.6)
AUGND: AUDIO_CODEC_CS4270 (13 pins), PSU (NT1#1.1), CON_AUDIO_AC99_NOMIC (J1#4.1 J3#2.1 J4.1 J5.1), AUDIO_AMP_NB2C (R14#3.1 R15#2.1 VR1.1), AUDIO_AMP_PT2300 (12 pins)
GND: VGA_OUT (U1#1.2), VIDEO_DAC_THS8134B (17 pins), Audio_Codec (U2000.1), AUDIO_CODEC_CS4270 (C2#2.2 C3#2.2 U1#3.6 U1#3.13), PSU (16 pins), FPGA (6 pins), USER_DECOUPLING_CAPS_1V2 (12 pins), USER_DECOUPLING_CAPS_3V3 (46 pins), FPGA_NonIO (135 pins), PULLDOWN (R311.1 R312.1 R313.1), PULLDOWN (R308.1 R309.1 R310.1), PULLDOWN (R305.1 R306.1 R307.1), PULLDOWN (R302.1 R303.1 R304.1), PULLDOWN (R299.1 R300.1 R301.1), PULLDOWN (R296.1 R297.1 R298.1), PULLDOWN (R293.1 R294.1 R295.1), PULLDOWN (R290.1 R291.1 R292.1), PWJACK+SWITCH (D10.1 J1#2.2 J1#2.3), Ethernet_RTL8201CL (50 pins), HOST_JTAG (J1#3.9 J1#3.10), Host_FPGA (R271.2 U69.2), HOST_FPGA_NonIO (43 pins), HOST_DECOUPLING_CAPS_1V2 (12 pins), HOST_DECOUPLING_CAPS_3V3 (46 pins), PULLDOWN (R287.1 R288.1 R289.1), PULLDOWN (R284.1 R285.1 R286.1), TSC_XPT2046 (NT11#2.1 U1#5.6 U1#5.7 U1#5.8), USB_CY7C68001-56LFC (21 pins), OSC_24MHZ (6 pins), CON_FFC40_LCDTFT (5 pins), CON_NB3000_ATE_INTF (J1#5.A38 J1#5.A39 J1#5.A40 J1#5.B38), AUDIO_AMP_NB2C (C6#4.2 C11#3.2 C12#3.2), CLK_ICS307-02_PLL (8 pins), CON_BATT_COIN (BT1.2), CON_MINI_USBB_RA_KME04-USBMU03A01-1 (J1#7.5), CON_ETHERNET_RJ45_LEDS (J1#8.8 J1#8.10), CON_NB3000_LEDKB (NT3#4.2 NT4#2.2 NT5#2.2 NT6.2), 1WB_DS2502_ID (D1#1.1 U1#10.1), CLK_PCF2123_RTC (5 pins)
SHIELD: PSU (C169.1 R248.1), PWJACK+SWITCH (SW1.S1 SW1.S2), Mounts (5 pins), CON_MINI_USBB_RA_KME04-USBMU03A01-1 (J1#7.6 J1#7.7 J1#7.8 J1#7.9), CON_ETHERNET_RJ45_LEDS (J1#8.MH1 J1#8.MH2), CON_MIDI_DIN5 (6 pins)
An_B: VGA_OUT (U1#1.3), VIDEO_DAC_THS8134B (R2#1.1 R3#1.2 U1#2.45)
An_G: VGA_OUT (U1#1.4), VIDEO_DAC_THS8134B (R4#1.1 R5#1.2 U1#2.41)
An_R: VGA_OUT (U1#1.1), VIDEO_DAC_THS8134B (R6#1.2 R7#1.2 U1#2.43)
CODEC_RST: Audio_Codec (R154#1.1 U2000.2), AUDIO_CODEC_CS4270 (U1#3.14)
CONF_DONE: FPGA (R22#1.2), FPGA_NonIO (U8.P24)
DCLK: FPGA (R20#1.2), FPGA_NonIO (U8.P3)
FLASH_BOOT_CLK: Host_FPGA (U30.L6), HOST_FPGA_NonIO (U30.H1)
LED0_B: FPGA (U8.R3), PULLDOWN (R311.2)
LED0_G: FPGA (U8.U1), PULLDOWN (R312.2)
LED0_R: FPGA (U8.R2), PULLDOWN (R313.2)
LED1_B: FPGA (U8.V4), PULLDOWN (R308.2)
LED1_BLUE: Host_FPGA (U30.R7), PULLDOWN (R287.2)
LED1_G: FPGA (U8.T3), PULLDOWN (R309.2)
LED1_GREEN: Host_FPGA (U30.K8), PULLDOWN (R288.2)
LED1_R: FPGA (U8.W9), PULLDOWN (R310.2)
LED1_RED: Host_FPGA (U30.F5), PULLDOWN (R289.2)
LED2_B: FPGA (U8.AD10), PULLDOWN (R305.2)
LED2_BLUE: Host_FPGA (U30.B1), PULLDOWN (R284.2)
LED2_G: FPGA (U8.AG11), PULLDOWN (R306.2)
LED2_GREEN: Host_FPGA (U30.R9), PULLDOWN (R285.2)
LED2_R: FPGA (U8.AC10), PULLDOWN (R307.2)
LED2_RED: Host_FPGA (U30.C2), PULLDOWN (R286.2)
LED3_B: FPGA (U8.AD11), PULLDOWN (R302.2)
LED3_G: FPGA (U8.AC12), PULLDOWN (R303.2)
LED3_R: FPGA (U8.Y13), PULLDOWN (R304.2)
LED4_B: FPGA (U8.AB23), PULLDOWN (R299.2)
LED4_G: FPGA (U8.AD26), PULLDOWN (R300.2)
LED4_R: FPGA (U8.AB24), PULLDOWN (R301.2)
LED5_B: FPGA (U8.AB20), PULLDOWN (R296.2)
LED5_G: FPGA (U8.AA24), PULLDOWN (R297.2)
LED5_R: FPGA (U8.AB25), PULLDOWN (R298.2)
LED6_B: FPGA (U8.AA25), PULLDOWN (R293.2)
LED6_G: FPGA (U8.AA23), PULLDOWN (R294.2)
LED6_R: FPGA (U8.W26), PULLDOWN (R295.2)
LED7_B: FPGA (U8.AD27), PULLDOWN (R290.2)
LED7_G: FPGA (U8.AC28), PULLDOWN (R291.2)
LED7_R: FPGA (U8.Y22), PULLDOWN (R292.2)
nCONFIG: FPGA (R24#1.2), FPGA_NonIO (U8.P4)
NetC15#2_2: AUDIO_AMP_NB2C (VR1.2), AUDIO_AMP_PT2300 (C15#2.2 U1#8.3)
NetR2#10_2: AUDIO_AMP_NB2C (5 pins), AUDIO_AMP_PT2300 (R11#4.1 U1#8.5)
NetR8#5_2: AUDIO_AMP_NB2C (6 pins), AUDIO_AMP_PT2300 (R18#3.1 U1#8.6)
nSTATUS: FPGA (R18#1.1), FPGA_NonIO (U8.M6)
TCK: FPGA (R9#2.2), FPGA_NonIO (U8.P5)
TDI: FPGA (R12#2.2), FPGA_NonIO (U8.P7)
TDO: FPGA (R10#2.2), FPGA_NonIO (U8.P6)
TMS: FPGA (R8#2.2), FPGA_NonIO (U8.P8)

## Assembly variants
Production: not fitted RN1 RN2 RN3 RN4 RN5 RN6 RN7 RN8 RN17 RN18 RN19 RN20 RN21 RN22 RN23 RN24 RN25 RN26 RN27 RN28 RN29 RN30 RN31 RN32